# EAGLE schematic 1700-0002_InterfaceBoard_RevA (EAGLE 7.7.0)
DRAWING_DATE: 4/15/2022; DRAWING_TITLE: PQI380 UNIV. INTERFACE BRD; PART_NUMBER: 7000-0303; REV: R12

## Sheet 1 of 2
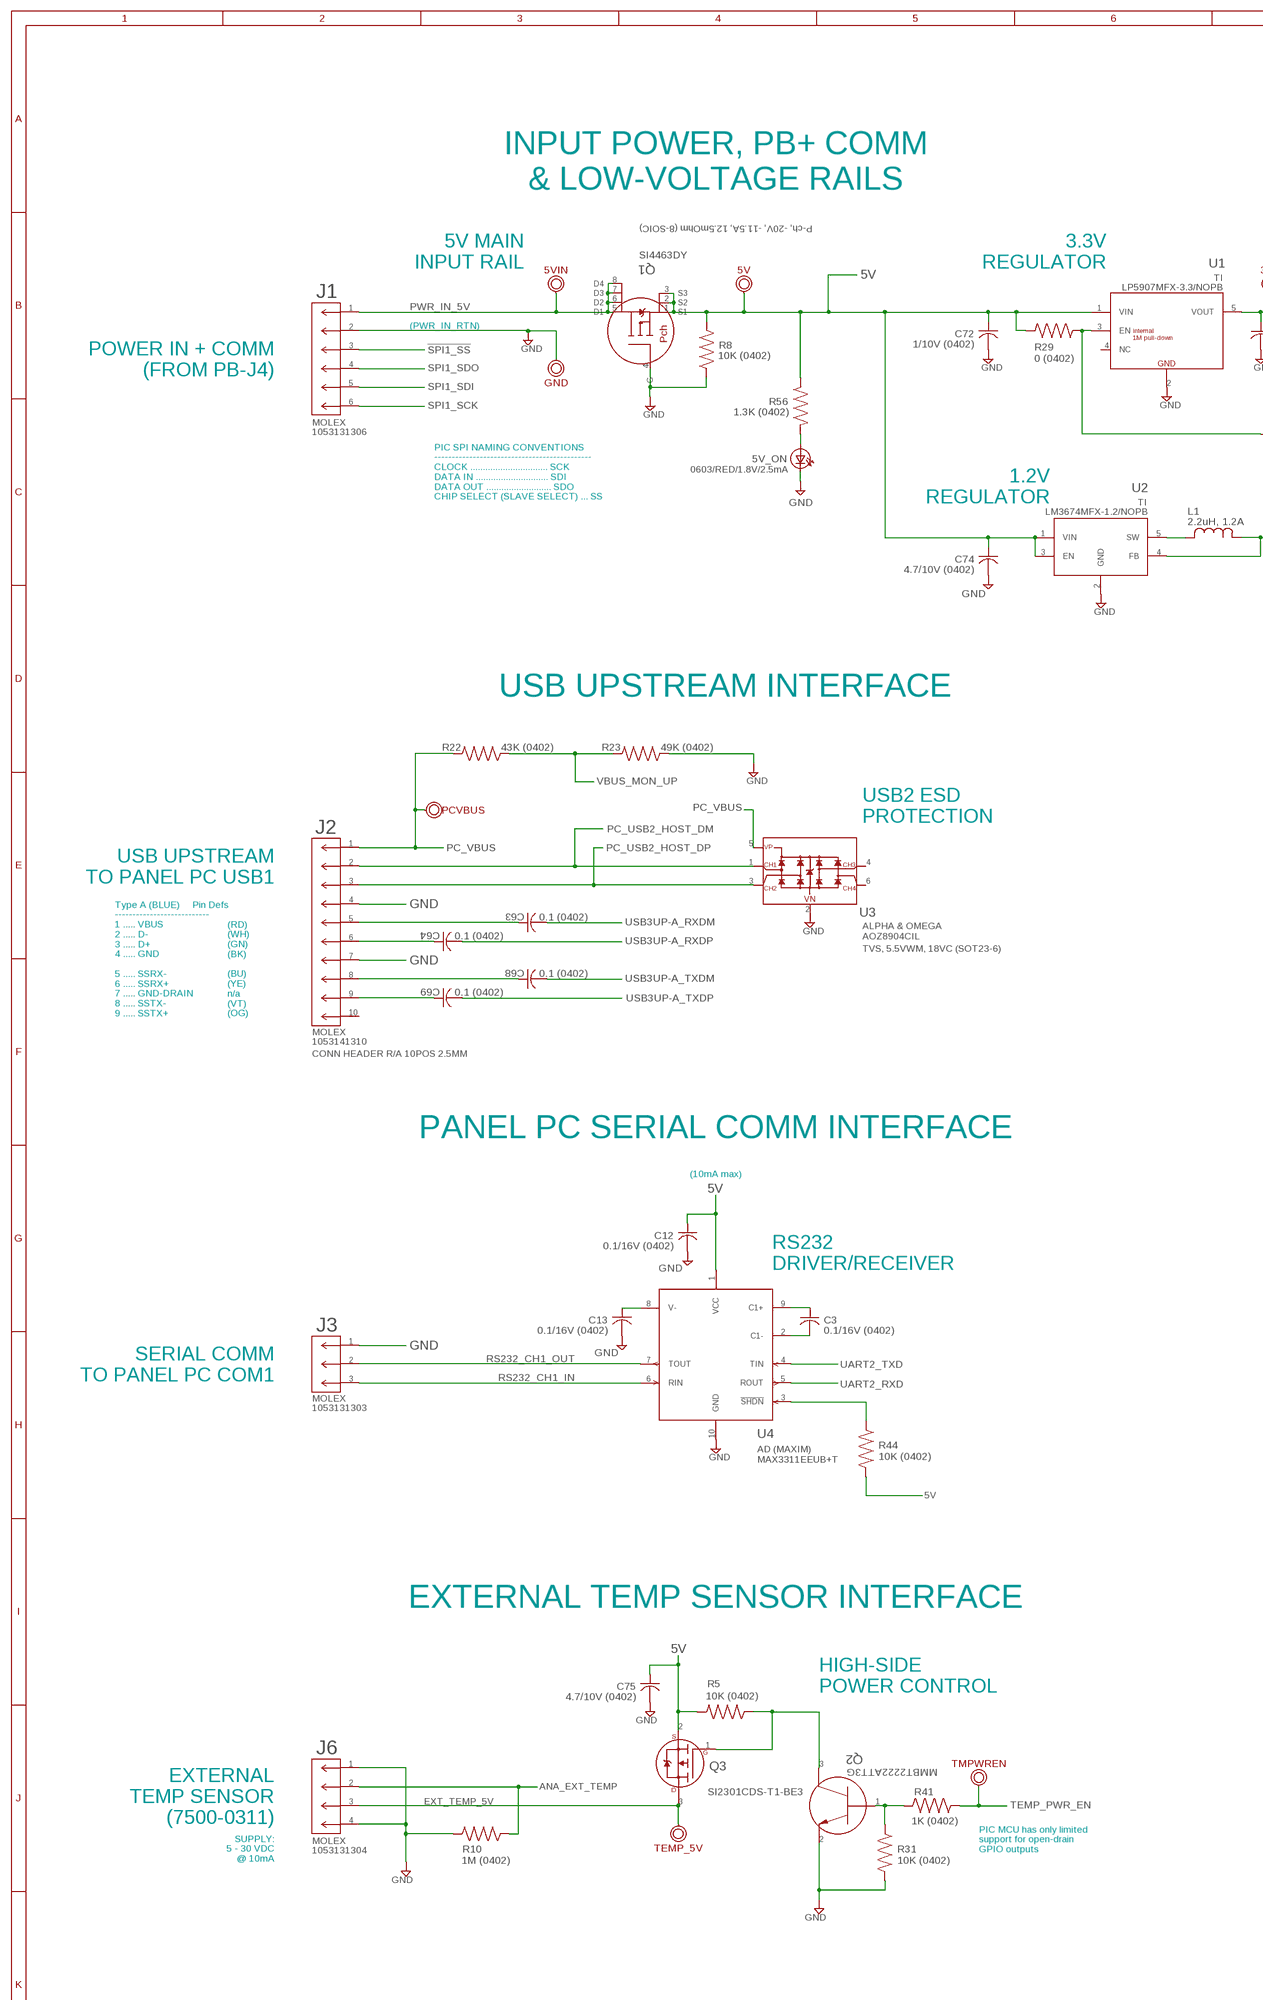
[diagram p0: schematic, sheet 1, part 1 of 3]
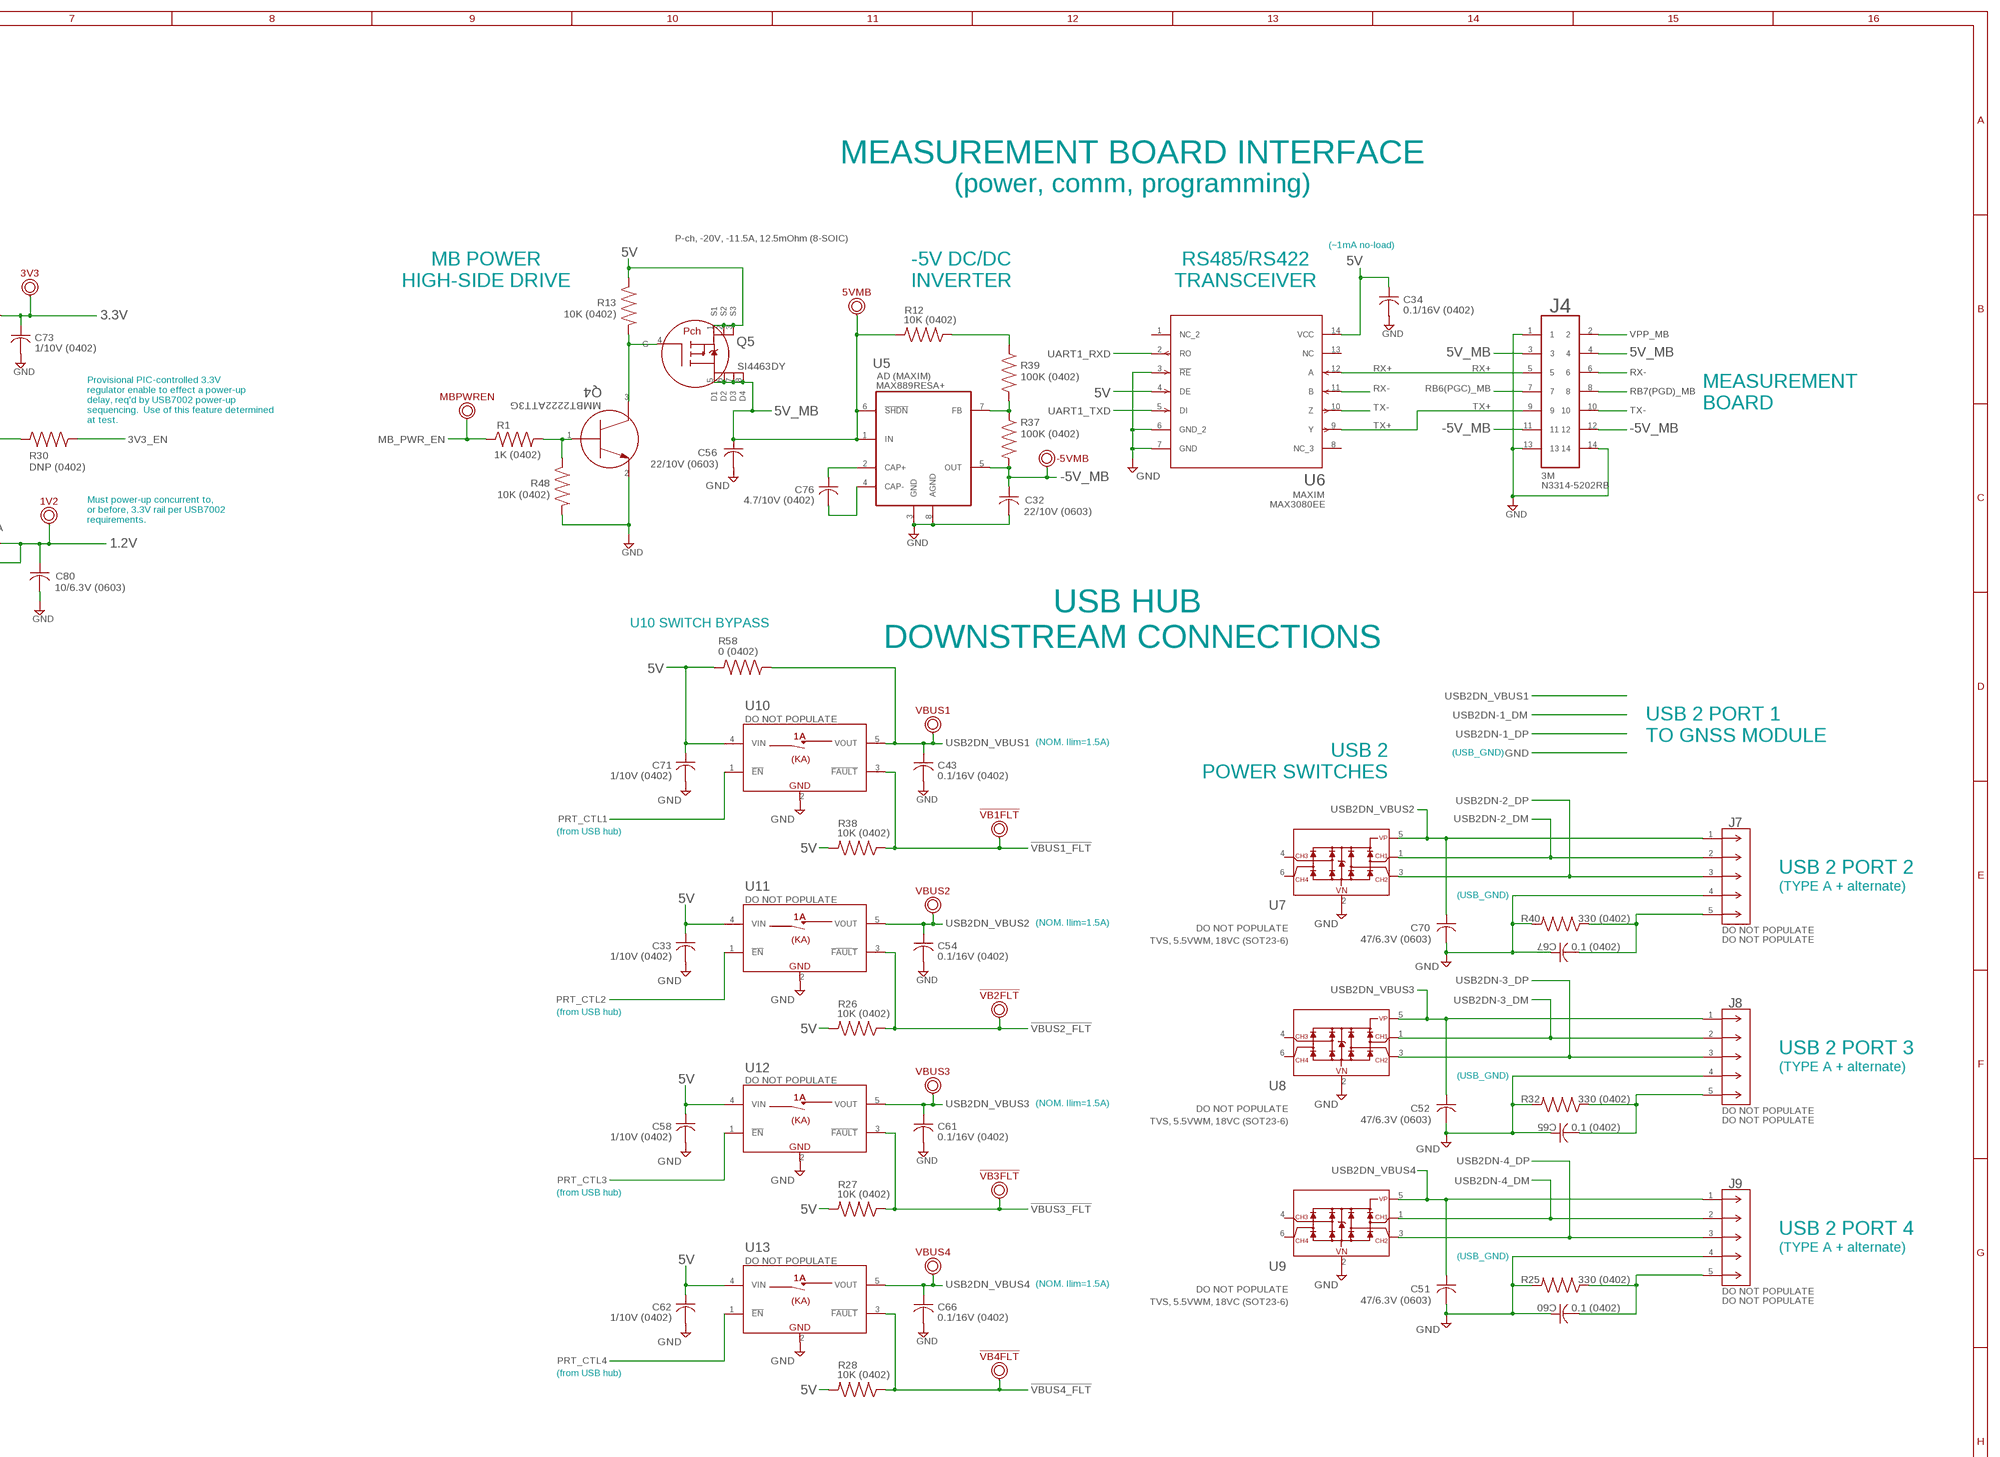
[diagram p1: schematic, sheet 1, part 2 of 3]
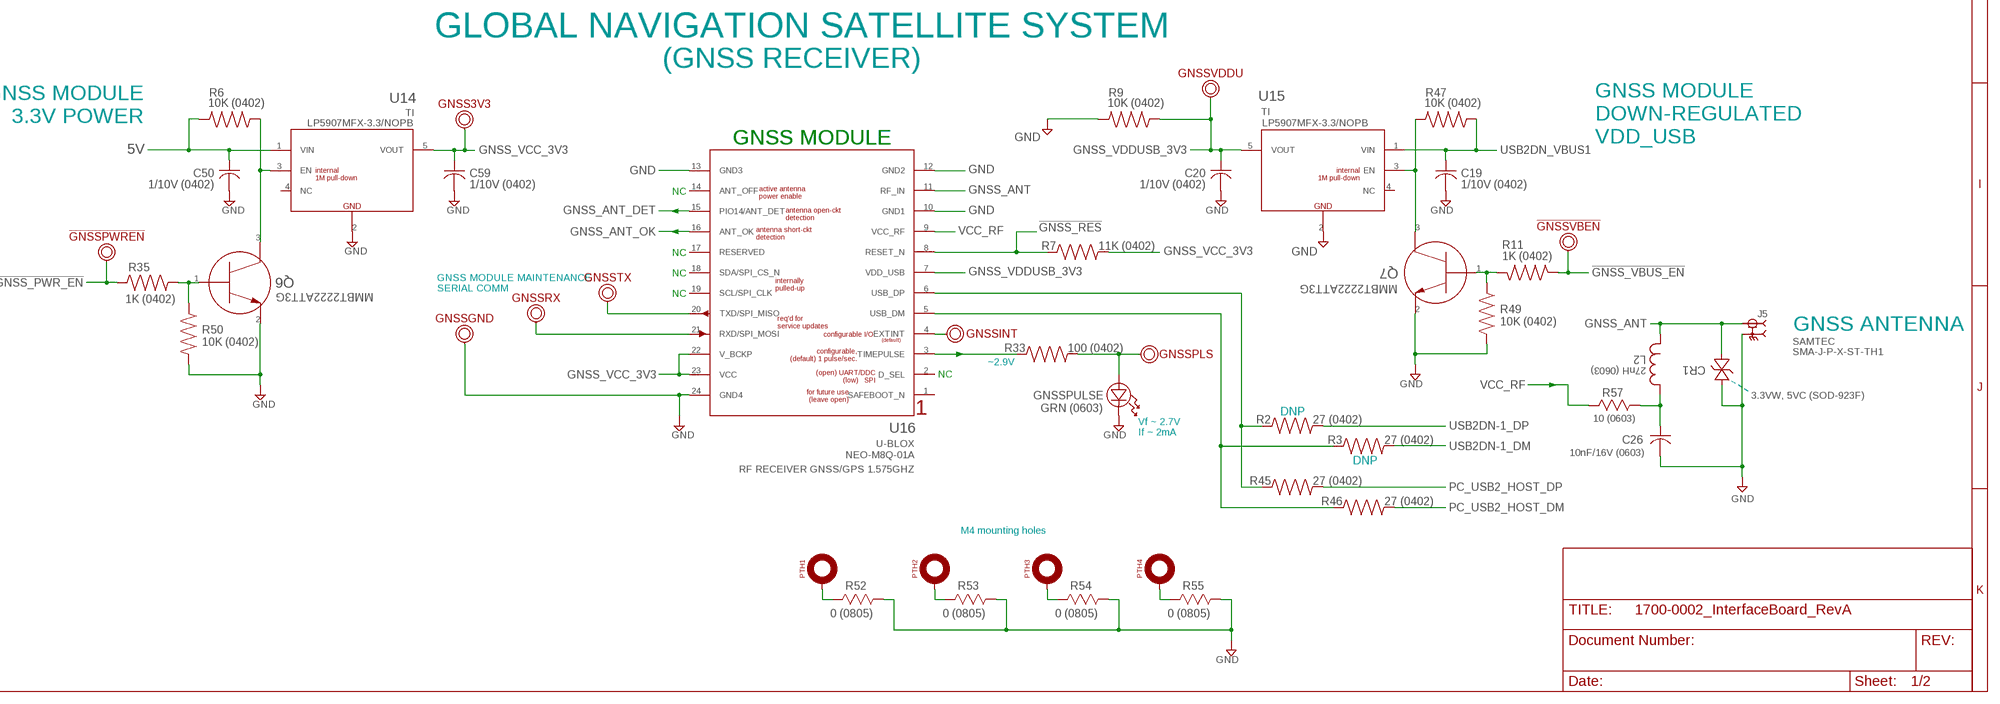
[diagram p2: schematic, sheet 1, part 3 of 3]
FRAME3 (FRAME_D_L): DWG-CO-NAME: TransTech Systems, Inc.; DWG-DATE: 4/22/2022; DWG-NUMBER: ____-____; DWG-REV: R0; DWG-TITLE: PQI380+ INTERFACE BOARD; SIZE: D

### Parts
1V2  TST_POINT_PTH_042-OCT  [TST_POINT_PTH_042-OCT]
3V3  TST_POINT_PTH_042-OCT  [TST_POINT_PTH_042-OCT]
5V  TST_POINT_PTH_042-OCT  [TST_POINT_PTH_042-OCT]
5V_ON  0603/RED/1.8V/2.5mA  LED_0603_LITE-ON_LTST-C193KRKT-2A  [LED_0603_LITE-ON]
5VIN  TST_POINT_PTH_042-OCT  [TST_POINT_PTH_042-OCT]
5VMB  TST_POINT_PTH_042-OCT  [TST_POINT_PTH_042-OCT]
!GNSSPWREN  TST_POINT_PTH_042-OCT  [TST_POINT_PTH_042-OCT]
!GNSSVBEN  TST_POINT_PTH_042-OCT  [TST_POINT_PTH_042-OCT]
!VB1FLT  TST_POINT_PTH_042-OCT  [TST_POINT_PTH_042-OCT]
!VB2FLT  TST_POINT_PTH_042-OCT  [TST_POINT_PTH_042-OCT]
!VB3FLT  TST_POINT_PTH_042-OCT  [TST_POINT_PTH_042-OCT]
!VB4FLT  TST_POINT_PTH_042-OCT  [TST_POINT_PTH_042-OCT]
-5VMB  TST_POINT_PTH_042-OCT  [TST_POINT_PTH_042-OCT]
C3  0.1/16V (0402)  CAP_CER_0402_MURATA  [G-155_MUR]
C12  0.1/16V (0402)  CAP_CER_0402_MURATA  [G-155_MUR]
C13  0.1/16V (0402)  CAP_CER_0402_MURATA  [G-155_MUR]
C19  1/10V (0402)  CAP_CER_0402_MURATA  [G-155_MUR]
C20  1/10V (0402)  CAP_CER_0402_MURATA  [G-155_MUR]
C26  10nF/16V (0603)  CAP_CER_0603_TDK  [CAP_C1608_TDK]
C32  22/10V (0603)  CAP_CER_0603_TDK  [CAP_C1608_TDK]
C33  1/10V (0402)  CAP_CER_0402_MURATA  [G-155_MUR]
C34  0.1/16V (0402)  CAP_CER_0402_MURATA  [G-155_MUR]
C43  0.1/16V (0402)  CAP_CER_0402_MURATA  [G-155_MUR]
C50  1/10V (0402)  CAP_CER_0402_MURATA  [G-155_MUR]
C51  47/6.3V (0603)  CAP_CER_0603_TDK  [CAP_C1608_TDK]
C52  47/6.3V (0603)  CAP_CER_0603_TDK  [CAP_C1608_TDK]
C54  0.1/16V (0402)  CAP_CER_0402_MURATA  [G-155_MUR]
C56  22/10V (0603)  CAP_CER_0603_TDK  [CAP_C1608_TDK]
C58  1/10V (0402)  CAP_CER_0402_MURATA  [G-155_MUR]
C59  1/10V (0402)  CAP_CER_0402_MURATA  [G-155_MUR]
C60  0.1 (0402)  CAP_CER_0402_MURATA  [G-155_MUR]
C61  0.1/16V (0402)  CAP_CER_0402_MURATA  [G-155_MUR]
C62  1/10V (0402)  CAP_CER_0402_MURATA  [G-155_MUR]
C63  0.1 (0402)  CAP_CER_0402_MURATA  [G-155_MUR]
C64  0.1 (0402)  CAP_CER_0402_MURATA  [G-155_MUR]
C65  0.1 (0402)  CAP_CER_0402_MURATA  [G-155_MUR]
C66  0.1/16V (0402)  CAP_CER_0402_MURATA  [G-155_MUR]
C67  0.1 (0402)  CAP_CER_0402_MURATA  [G-155_MUR]
C68  0.1 (0402)  CAP_CER_0402_MURATA  [G-155_MUR]
C69  0.1 (0402)  CAP_CER_0402_MURATA  [G-155_MUR]
C70  47/6.3V (0603)  CAP_CER_0603_TDK  [CAP_C1608_TDK]
C71  1/10V (0402)  CAP_CER_0402_MURATA  [G-155_MUR]
C72  1/10V (0402)  CAP_CER_0402_MURATA  [G-155_MUR]
C73  1/10V (0402)  CAP_CER_0402_MURATA  [G-155_MUR]
C74  4.7/10V (0402)  CAP_CER_0402_MURATA  [G-155_MUR]
C75  4.7/10V (0402)  CAP_CER_0402_MURATA  [G-155_MUR]
C76  4.7/10V (0402)  CAP_CER_0402_MURATA  [G-155_MUR]
C80  10/6.3V (0603)  CAP_CER_0603_TDK  [CAP_C1608_TDK]
CR1  3.3VW, 5VC (SOD-923F)  DIODE_TVS_BIDIRECT_COMCHIP  [SOD-923F_COMCHIP]
GND  TST_POINT_PTH_042-OCT  [TST_POINT_PTH_042-OCT]
GNSS3V3  TST_POINT_PTH_042-OCT  [TST_POINT_PTH_042-OCT]
GNSSGND  TST_POINT_PTH_042-OCT  [TST_POINT_PTH_042-OCT]
GNSSINT  TST_POINT_PTH_042-OCT  [TST_POINT_PTH_042-OCT]
GNSSPLS  TST_POINT_PTH_042-OCT  [TST_POINT_PTH_042-OCT]
GNSSPULSE  GRN (0603)  LED_0603  [LED_DIALIGHT_598_DIA]
GNSSRX  TST_POINT_PTH_042-OCT  [TST_POINT_PTH_042-OCT]
GNSSTX  TST_POINT_PTH_042-OCT  [TST_POINT_PTH_042-OCT]
GNSSVDDU  TST_POINT_PTH_042-OCT  [TST_POINT_PTH_042-OCT]
J1  CON_MOLEX_1053131306  [CON_1053131306]
J2  CON_MOLEX_1053141310  [CON_1053141310]
J3  CON_MOLEX_1053131303  [CON_1053131303]
J4  CON_3M_RA_N3314-5302RB  [3M_N3314-5302RB_RA]
J5  SAMTEC_SMA-J-P-X-ST-TH1_V.2  [SAMTEC_SMA-J-P-X-ST-TH1]
J6  CON_MOLEX_1053131304  [CON_1053131304]
J7  CON_MOLEX_1054301305  [CON_1054301305_MOL]
J8  CON_MOLEX_1054301305  [CON_1054301305_MOL]
J9  CON_MOLEX_1054301305  [CON_1054301305_MOL]
L1  2.2uH, 1.2A  IND_TAIYO-YUDEN_NR3012T2R2M  [IND_TAIYO_NR3012_TAY]
L2  27nH (0603)  INDUCTOR_0603_TDK  [INDUCTOR_0603_TDK]
MBPWREN  TST_POINT_PTH_042-OCT  [TST_POINT_PTH_042-OCT]
PCVBUS  TST_POINT_PTH_042-OCT  [TST_POINT_PTH_042-OCT]
PTH1  PTH_M4_4.5MM-ID_MIDDLE-FIT  [PTH_M4_4.5MM-ID]
PTH2  PTH_M4_4.5MM-ID_MIDDLE-FIT  [PTH_M4_4.5MM-ID]
PTH3  PTH_M4_4.5MM-ID_MIDDLE-FIT  [PTH_M4_4.5MM-ID]
PTH4  PTH_M4_4.5MM-ID_MIDDLE-FIT  [PTH_M4_4.5MM-ID]
Q1  P-ch, -20V, -11.5A, 12.5mOhm (8-SOIC)  FDS4435BZ  [SO-8L-NB_FAS]
Q2  MMBT2222ATT3G  [SC-75(SOT-416)_ONSEMI]
Q3  P-CH/-20V/-3A/0.09OHM  MOSFET_P-CH_VISHAY_SI2301CDS-T1-BE3  [SOT_1CDS-T1-BE3_VIS]
Q4  MMBT2222ATT3G  [SC-75(SOT-416)_ONSEMI]
Q5  P-ch, -20V, -11.5A, 12.5mOhm (8-SOIC)  FDS4435BZ  [SO-8L-NB_FAS]
Q6  MMBT2222ATT3G  [SC-75(SOT-416)_ONSEMI]
Q7  MMBT2222ATT3G  [SC-75(SOT-416)_ONSEMI]
R1  1K (0402)  RES_0402_VISHAY  [RESC1005X35N]
R2  27 (0402)  RES_0402_VISHAY  [RESC1005X35N]
R3  27 (0402)  RES_0402_VISHAY  [RESC1005X35N]
R5  10K (0402)  RES_0402_VISHAY  [RESC1005X35N]
R6  10K (0402)  RES_0402_VISHAY  [RESC1005X35N]
R7  11K (0402)  RES_0402_VISHAY  [RESC1005X35N]
R8  10K (0402)  RES_0402_VISHAY  [RESC1005X35N]
R9  10K (0402)  RES_0402_VISHAY  [RESC1005X35N]
R10  1M (0402)  RES_0402_VISHAY  [RESC1005X35N]
R11  1K (0402)  RES_0402_VISHAY  [RESC1005X35N]
R12  10K (0402)  RES_0402_VISHAY  [RESC1005X35N]
R13  10K (0402)  RES_0402_VISHAY  [RESC1005X35N]
R22  43K (0402)  RES_0402_VISHAY  [RESC1005X35N]
R23  49K (0402)  RES_0402_VISHAY  [RESC1005X35N]
R25  330 (0402)  RES_0402_VISHAY  [RESC1005X35N]
R26  10K (0402)  RES_0402_VISHAY  [RESC1005X35N]
R27  10K (0402)  RES_0402_VISHAY  [RESC1005X35N]
R28  10K (0402)  RES_0402_VISHAY  [RESC1005X35N]
R29  0 (0402)  RES_0402_VISHAY  [RESC1005X35N]
R30  DNP (0402)  RES_0402_VISHAY  [RESC1005X35N]
R31  10K (0402)  RES_0402_VISHAY  [RESC1005X35N]
R32  330 (0402)  RES_0402_VISHAY  [RESC1005X35N]
R33  100 (0402)  RES_0402_VISHAY  [RESC1005X35N]
R35  1K (0402)  RES_0402_VISHAY  [RESC1005X35N]
R37  100K (0402)  RES_0402_VISHAY  [RESC1005X35N]
R38  10K (0402)  RES_0402_VISHAY  [RESC1005X35N]
R39  100K (0402)  RES_0402_VISHAY  [RESC1005X35N]
R40  330 (0402)  RES_0402_VISHAY  [RESC1005X35N]
R41  1K (0402)  RES_0402_VISHAY  [RESC1005X35N]
R44  10K (0402)  RES_0402_VISHAY  [RESC1005X35N]
R45  27 (0402)  RES_0402_VISHAY  [RESC1005X35N]
R46  27 (0402)  RES_0402_VISHAY  [RESC1005X35N]
R47  10K (0402)  RES_0402_VISHAY  [RESC1005X35N]
R48  10K (0402)  RES_0402_VISHAY  [RESC1005X35N]
R49  10K (0402)  RES_0402_VISHAY  [RESC1005X35N]
R50  10K (0402)  RES_0402_VISHAY  [RESC1005X35N]
R52  0 (0805)  RES_0805_STACKPOLE  [STA_HCJ0805_STP]
R53  0 (0805)  RES_0805_STACKPOLE  [STA_HCJ0805_STP]
R54  0 (0805)  RES_0805_STACKPOLE  [STA_HCJ0805_STP]
R55  0 (0805)  RES_0805_STACKPOLE  [STA_HCJ0805_STP]
R56  1.3K (0402)  RES_0402_VISHAY  [RESC1005X35N]
R57  10 (0603)  RES_0603_STACKPOLE  [STA_RMCF0603_STP]
R58  0 (0402)  RES_0402_VISHAY  [RESC1005X35N]
TEMP_5V  TST_POINT_PTH_042-OCT  [TST_POINT_PTH_042-OCT]
TMPWREN  TST_POINT_PTH_042-OCT  [TST_POINT_PTH_042-OCT]
U1  TI_LP5907MFX-3.3/NOPBDBV0005A_L  [DBV0005A_L]
U2  TI_SW-REG_LM3671  [DBV5_TEX]
U3  TVS, 5.5VWM, 18VC (SOT23-6)  TVS_ALPHA-OEGA_AOZ8904CIL  [SOT-23-6_AOS]
U4  MAXIM_MAX3311EEUB+T  [21-0061L_MXM]
U5  MAXIM_MAX889RESA  [SOIC127P600X175-8N]
U6  MAX3080EESD+  [21-0041B_14_MXM]
U7  TVS, 5.5VWM, 18VC (SOT23-6)  TVS_ALPHA-OEGA_AOZ8904CIL  [SOT-23-6_AOS]
U8  TVS, 5.5VWM, 18VC (SOT23-6)  TVS_ALPHA-OEGA_AOZ8904CIL  [SOT-23-6_AOS]
U9  TVS, 5.5VWM, 18VC (SOT23-6)  TVS_ALPHA-OEGA_AOZ8904CIL  [SOT-23-6_AOS]
U10  SW_PWR_1CH_DIODES-INC_AP22816BKAWT  [TSOT-25_DIODES-INC]
U11  SW_PWR_1CH_DIODES-INC_AP22816BKAWT  [TSOT-25_DIODES-INC]
U12  SW_PWR_1CH_DIODES-INC_AP22816BKAWT  [TSOT-25_DIODES-INC]
U13  SW_PWR_1CH_DIODES-INC_AP22816BKAWT  [TSOT-25_DIODES-INC]
U14  TI_LP5907MFX-3.3/NOPBDBV0005A_L  [DBV0005A_L]
U15  TI_LP5907MFX-3.3/NOPBDBV0005A_L  [DBV0005A_L]
U16  MODULE_UBLOX_NEO-M8Q-01A  [UBLOX_24LCC]
VBUS1  TST_POINT_PTH_042-OCT  [TST_POINT_PTH_042-OCT]
VBUS2  TST_POINT_PTH_042-OCT  [TST_POINT_PTH_042-OCT]
VBUS3  TST_POINT_PTH_042-OCT  [TST_POINT_PTH_042-OCT]
VBUS4  TST_POINT_PTH_042-OCT  [TST_POINT_PTH_042-OCT]

### Nets
1.2V: 1V2.P$1 C80.1 L1.1 U2.4(FB) ; also sheet 2
3.3V: 3V3.P$1 C73.1 U1.5(VOUT) ; also sheet 2
3V3_EN: R30.2 ; also sheet 2
5V: 5V.P$1 C12.1 C33.1 C34.1 C50.1 C58.1 C62.1 C71.1 C72.1 C74.1 C75.1 Q1.1(S1) Q1.2(S2) Q1.3(S3) Q3.2(S) Q5.1(S1) Q5.2(S2) Q5.3(S3) R5.2 R6.2 R8.2 R13.1 R26.2 R27.2 R28.2 R29.1 R38.2 R44.2 R56.2 R58.1 U1.1(VIN) U2.1(VIN) U2.3(EN) U4.1(VCC) U6.4(DE) U6.14(VCC) U10.4(VIN) U11.4(VIN) U12.4(VIN) U13.4(VIN) U14.1(VIN) ; also sheet 2
5V_MB: 5VMB.P$1 C56.1 J4.3 J4.4 Q5.5(D1) Q5.6(D2) Q5.7(D3) Q5.8(D4) R12.2 U5.1(IN) U5.6(!SHDN) ; also sheet 2
!GNSS_PWR_EN: !GNSSPWREN.P$1 R35.1 ; also sheet 2
!GNSS_RES: R7.1 U16.8(RESET_N) ; also sheet 2
!GNSS_VBUS_EN: !GNSSVBEN.P$1 R11.1 ; also sheet 2
!SPI1_SS: J1.3 ; also sheet 2
!VBUS1_FLT: !VB1FLT.P$1 R38.1 U10.3(!FAULT) ; also sheet 2
!VBUS2_FLT: !VB2FLT.P$1 R26.1 U11.3(!FAULT) ; also sheet 2
!VBUS3_FLT: !VB3FLT.P$1 R27.1 U12.3(!FAULT) ; also sheet 2
!VBUS4_FLT: !VB4FLT.P$1 R28.1 U13.3(!FAULT) ; also sheet 2
-5V_MB: -5VMB.P$1 C32.1 J4.11 J4.12 R37.2 U5.5(OUT)
ANA_EXT_TEMP: J6.2 R10.1 ; also sheet 2
EXT_TEMP_5V: J6.3 Q3.3(D) TEMP_5V.P$1
GND: 5V_ON.1(K2) C12.2 C13.2 C19.2 C20.2 C26.2 C32.2 C33.2 C34.2 C43.2 C50.2 C51.2 C52.2 C54.2 C56.2 C58.2 C59.2 C60.1 C61.2 C62.2 C65.1 C66.2 C67.1 C70.2 C71.2 C72.2 C73.2 C74.2 C75.2 C80.2 CR1.2(K) GND.P$1 GNSSGND.P$1 GNSSPULSE.1 J1.2 J2.4 J2.7 J3.1 J4.1 J4.13 J4.14 J5.2 J5.3 J5.4 J5.5 J6.1 J6.4 J7.4 J8.4 J9.4 Q1.4(G) Q2.2(E) Q4.2(E) Q6.2(E) Q7.2(E) R8.1 R9.2 R10.2 R23.1 R25.2 R31.2 R32.2 R40.2 R48.2 R49.2 R50.2 R52.1 R53.1 R54.1 R55.1 U1.2(GND) U2.2(GND) U3.2(VN) U4.10(GND) U5.3(GND) U5.8(AGND) U6.3(!RE) U6.6(GND_2) U6.7(GND) U7.2(VN) U8.2(VN) U9.2(VN) U10.2(GND) U11.2(GND) U12.2(GND) U13.2(GND) U14.2(GND) U15.2(GND) U16.10(GND1) U16.12(GND2) U16.13(GND3) U16.24(GND4) ; also sheet 2
GNSS_ANT: CR1.1(A) J5.1 L2.1 U16.11(RF_IN)
GNSS_ANT_DET: U16.15(PIO14/ANT_DET) ; also sheet 2
GNSS_ANT_OK: U16.16(ANT_OK) ; also sheet 2
GNSS_VCC_3V3: C59.1 GNSS3V3.P$1 R7.2 U14.5(VOUT) U16.22(V_BCKP) U16.23(VCC)
GNSS_VDDUSB_3V3: C20.1 GNSSVDDU.P$1 R9.1 U15.5(VOUT) U16.7(VDD_USB)
MB_PWR_EN: MBPWREN.P$1 R1.1 ; also sheet 2
N$1: L1.2 U2.5(SW)
N$2: C3.1 U4.9(C1+)
N$3: PTH1.P$1 R52.2
N$4: C3.2 U4.2(C1-)
N$5: C13.1 U4.8(V-)
N$6: R29.2 R30.1 U1.3(EN)
N$8: PTH2.P$1 R53.2
N$9: Q2.3(C) Q3.1(G) R5.1
N$10: Q2.1(B) R31.1 R41.1
N$11: R2.1 R45.1 U16.6(USB_DP)
N$12: R3.1 R46.1 U16.5(USB_DM)
N$13: Q6.3(C) R6.1 U14.3(EN)
N$14: GNSSTX.P$1 U16.20(TXD/SPI_MISO)
N$15: PTH3.P$1 R54.2
N$16: Q6.1(B) R35.2 R50.1
N$17: Q7.3(C) R47.2 U15.3(EN)
N$18: C60.2 J9.5 R25.1
N$19: PTH4.P$1 R55.2
N$21: Q4.3(C) Q5.4(G) R13.2
N$22: C65.2 J8.5 R32.1
N$23: R37.1 R39.2 U5.7(FB)
N$24: C69.1 J2.9
N$25: C68.1 J2.8
N$26: C64.1 J2.6
N$27: C63.1 J2.5
N$36: Q4.1(B) R1.2 R48.1
N$38: GNSSRX.P$1 U16.21(RXD/SPI_MOSI)
N$41: R33.1 U16.3(TIMEPULSE)
N$42: GNSSINT.P$1 U16.4(EXTINT)
N$44: R12.1 R39.1
N$45: C76.1 U5.2(CAP+)
N$46: C76.2 U5.4(CAP-)
N$50: 5V_ON.2(A2) R56.1
N$51: GNSSPLS.P$1 GNSSPULSE.2 R33.2
N$52: C67.2 J7.5 R40.1
N$57: R44.1 U4.3(!SHDN)
N$59: C26.1 L2.2 R57.1
PC_USB2_HOST_DM: J2.2 R46.2 U3.1(CH1) ; also sheet 2
PC_USB2_HOST_DP: J2.3 R45.2 U3.3(CH2) ; also sheet 2
PC_VBUS: J2.1 PCVBUS.P$1 R22.2 U3.5(VP)
PRT_CTL1: U10.1(!EN) ; also sheet 2
PRT_CTL2: U11.1(!EN) ; also sheet 2
PRT_CTL3: U12.1(!EN) ; also sheet 2
PRT_CTL4: U13.1(!EN) ; also sheet 2
PWR_BYP2: Q7.1(B) R11.2 R49.1
PWR_IN_5V: 5VIN.P$1 J1.1 Q1.5(D1) Q1.6(D2) Q1.7(D3) Q1.8(D4)
RB6(PGC)_MB: J4.7 ; also sheet 2
RB7(PGD)_MB: J4.8 ; also sheet 2
RS232_CH1_IN: J3.3 U4.6(RIN)
RS232_CH1_OUT: J3.2 U4.7(TOUT)
RX+: J4.5 U6.12(A)
RX-: J4.6 U6.11(B)
SPI1_SCK: J1.6 ; also sheet 2
SPI1_SDI: J1.5 ; also sheet 2
SPI1_SDO: J1.4 ; also sheet 2
TEMP_PWR_EN: R41.2 TMPWREN.P$1 ; also sheet 2
TX+: J4.9 U6.9(Y)
TX-: J4.10 U6.10(Z)
UART1_RXD: U6.2(RO) ; also sheet 2
UART1_TXD: U6.5(DI) ; also sheet 2
UART2_RXD: U4.5(ROUT) ; also sheet 2
UART2_TXD: U4.4(TIN) ; also sheet 2
USB2DN-1_DM: R3.2 ; also sheet 2
USB2DN-1_DP: R2.2 ; also sheet 2
USB2DN-2_DM: J7.2 U7.1(CH1) ; also sheet 2
USB2DN-2_DP: J7.3 U7.3(CH2) ; also sheet 2
USB2DN-3_DM: J8.2 U8.1(CH1) ; also sheet 2
USB2DN-3_DP: J8.3 U8.3(CH2) ; also sheet 2
USB2DN-4_DM: J9.2 U9.1(CH1) ; also sheet 2
USB2DN-4_DP: J9.3 U9.3(CH2) ; also sheet 2
USB2DN_VBUS1: C19.1 C43.1 R47.1 R58.2 U10.5(VOUT) U15.1(VIN) VBUS1.P$1
USB2DN_VBUS2: C54.1 C70.1 J7.1 U7.5(VP) U11.5(VOUT) VBUS2.P$1
USB2DN_VBUS3: C52.1 C61.1 J8.1 U8.5(VP) U12.5(VOUT) VBUS3.P$1
USB2DN_VBUS4: C51.1 C66.1 J9.1 U9.5(VP) U13.5(VOUT) VBUS4.P$1
USB3UP-A_RXDM: C63.2 ; also sheet 2
USB3UP-A_RXDP: C64.2 ; also sheet 2
USB3UP-A_TXDM: C68.2 ; also sheet 2
USB3UP-A_TXDP: C69.2 ; also sheet 2
VBUS_MON_UP: R22.1 R23.2 ; also sheet 2
VCC_RF: R57.2 U16.9(VCC_RF)
VPP_MB: J4.2 ; also sheet 2
Unconnected: J2.10 U1.4(NC) U3.4(CH3) U3.6(CH4) U6.1(NC_2) U6.8(NC_3) U6.13(NC) U7.4(CH3) U7.6(CH4) U8.4(CH3) U8.6(CH4) U9.4(CH3) U9.6(CH4) U14.4(NC) U15.4(NC) U16.1(SAFEBOOT_N) U16.2(D_SEL) U16.14(ANT_OFF) U16.17(RESERVED) U16.18(SDA/SPI_CS_N) U16.19(SCL/SPI_CLK)

### Notes on the sheet
- MEASUREMENT BOARD INTERFACE
- INPUT POWER, PB+ COMM
  & LOW-VOLTAGE RAILS
- (power, comm, programming)
- (~1mA no-load)
- 5V MAIN
  INPUT RAIL
- 3.3V
  REGULATOR
- MB POWER
  HIGH-SIDE DRIVE
- -5V DC/DC
  INVERTER
- RS485/RS422
  TRANSCEIVER
- (PWR_IN_RTN)
- POWER IN + COMM
  (FROM PB-J4)
- Provisional PIC-controlled 3.3V
  regulator enable to effect a power-up
  delay, req'd by USB7002 power-up
  sequencing.  Use of this feature determined
  at test.
- MEASUREMENT
  BOARD
- Must power-up concurrent to,
  or before, 3.3V rail per USB7002
  requirements.
- PIC SPI NAMING CONVENTIONS
  ---------------------------------------------
  CLOCK ............................... SCK
  DATA IN ............................. SDI
  DATA OUT .......................... SDO
  CHIP SELECT (SLAVE SELECT) ... SS
- 1.2V
  REGULATOR
- U10 SWITCH BYPASS
- USB HUB 
  DOWNSTREAM CONNECTIONS
- USB UPSTREAM INTERFACE
- USB 2 PORT 1
  TO GNSS MODULE
- (NOM. Ilim=1.5A)
- (USB_GND)
- USB 2
  POWER SWITCHES
- USB2 ESD
  PROTECTION
- (from USB hub)
- USB 2 PORT 2
- USB UPSTREAM
  TO PANEL PC USB1
- (TYPE A + alternate)
- (USB_GND)
- (NOM. Ilim=1.5A)
- (from USB hub)
- Type A (BLUE)     Pin Defs
  ---------------------------
  1 ..... VBUS
  2 ..... D-
  3 ..... D+
  4 ..... GND
  
  5 ..... SSRX-
  6 ..... SSRX+
  7 ..... GND-DRAIN
  8 ..... SSTX-
  9 ..... SSTX+
- (RD)
  (WH)
  (GN)
  (BK)
  
  (BU)
  (YE)
  n/a
  (VT)
  (OG)
- USB 2 PORT 3
- (TYPE A + alternate)
- (USB_GND)
- (NOM. Ilim=1.5A)
- PANEL PC SERIAL COMM INTERFACE
- (10mA max)
- (from USB hub)
- USB 2 PORT 4
- (TYPE A + alternate)
- (USB_GND)
- RS232
  DRIVER/RECEIVER
- (NOM. Ilim=1.5A)
- (from USB hub)
- SERIAL COMM
  TO PANEL PC COM1
- GLOBAL NAVIGATION SATELLITE SYSTEM
- (GNSS RECEIVER)
- GNSS MODULE
  3.3V POWER
- GNSS MODULE
  DOWN-REGULATED
  VDD_USB
- GNSS MODULE | GNSS MODULE
- EXTERNAL TEMP SENSOR INTERFACE
- NC
- NC
- HIGH-SIDE
  POWER CONTROL
- NC
- GNSS MODULE MAINTENANCE
  SERIAL COMM
- NC
- GNSS ANTENNA
- ~2.9V
- NC
- EXTERNAL
  TEMP SENSOR
  (7500-0311)
- DNP
- Vf ~ 2.7V
  If ~ 2mA
- PIC MCU has only limited
  support for open-drain
  GPIO outputs
- SUPPLY:
  5 - 30 VDC
  @ 10mA
- DNP
- M4 mounting holes

## Sheet 2 of 2
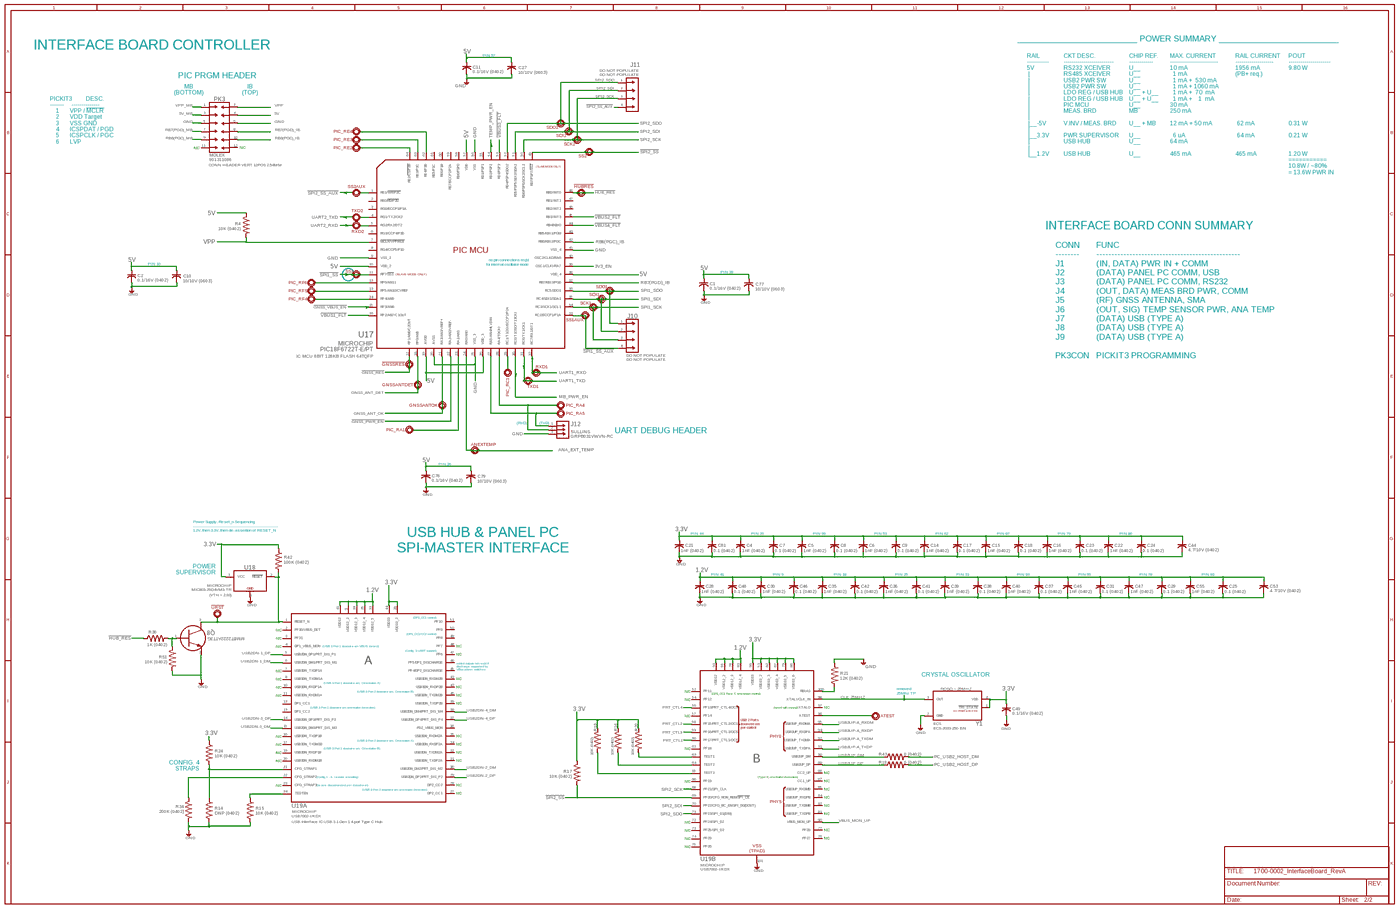
[diagram p3: schematic, sheet 2, overview]
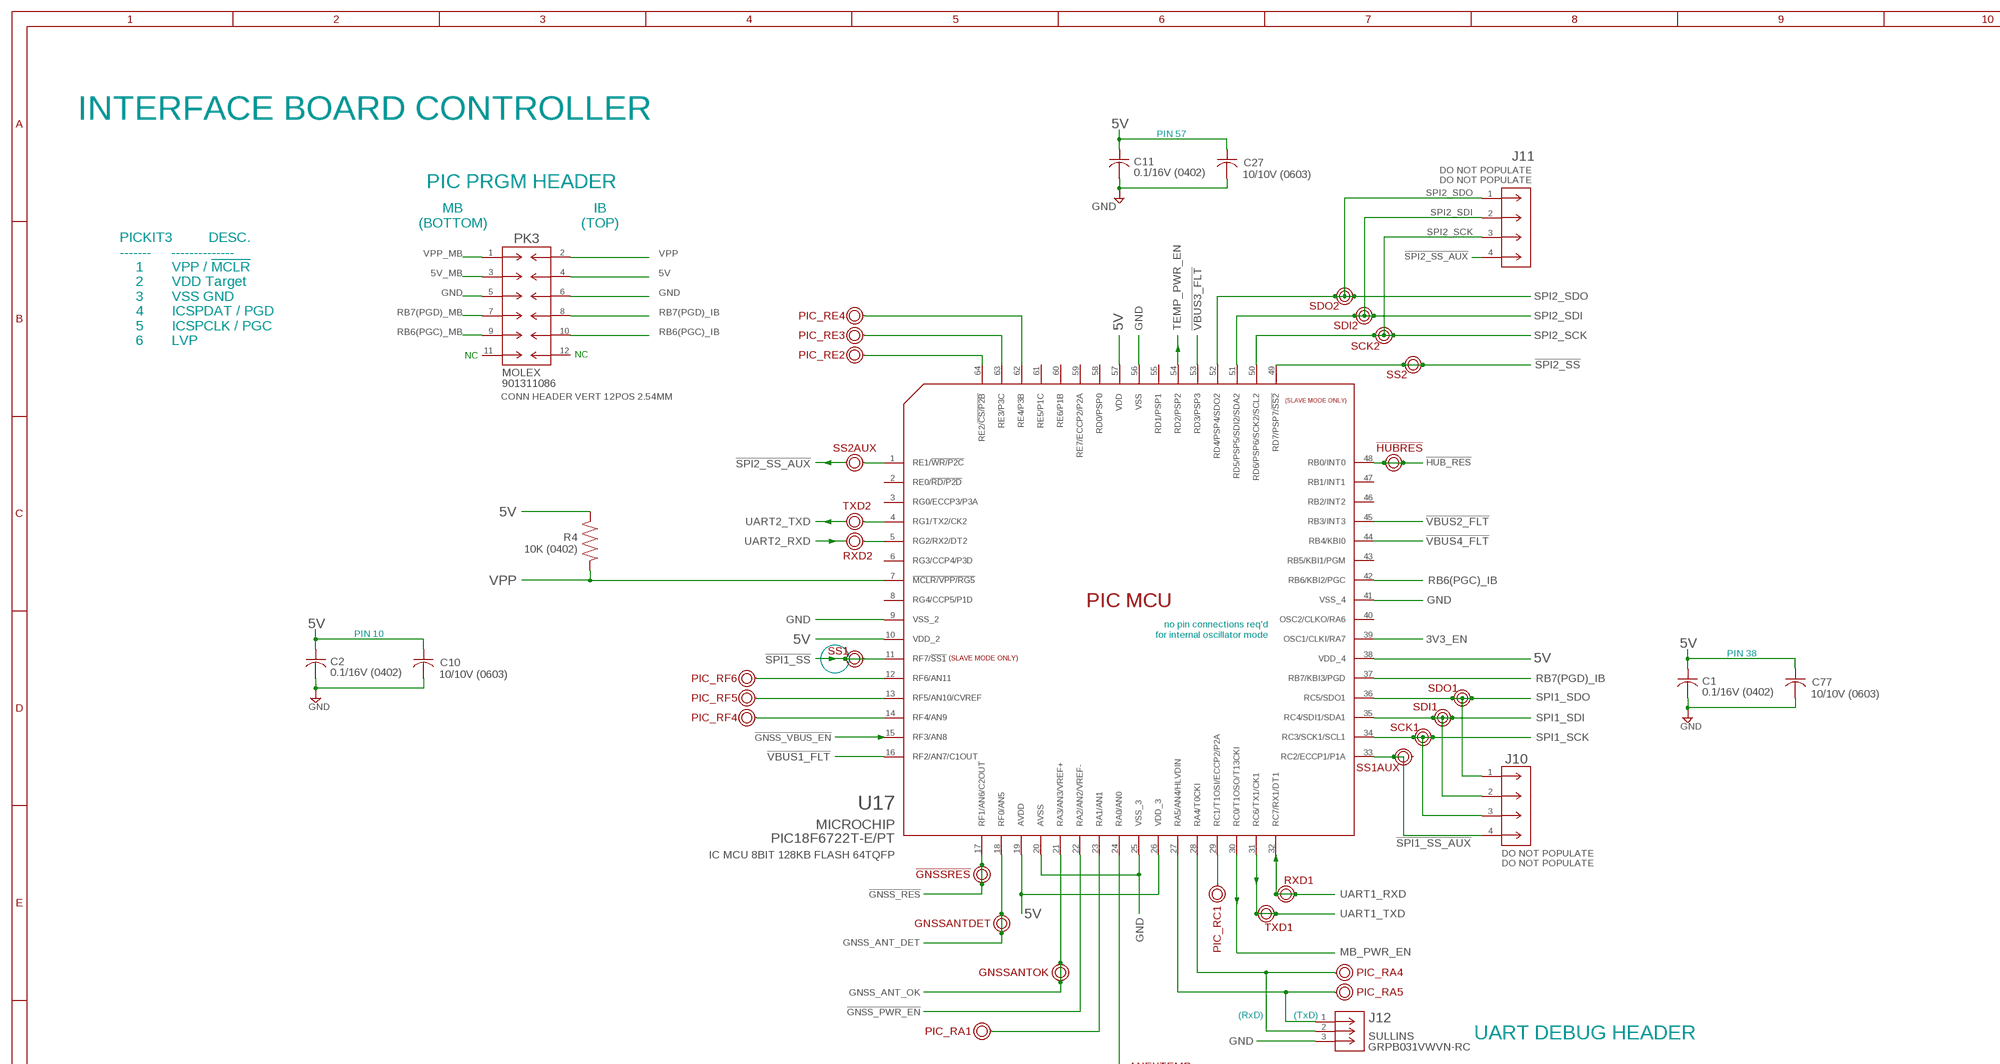
[diagram p4: schematic, sheet 2, part 1 of 4]
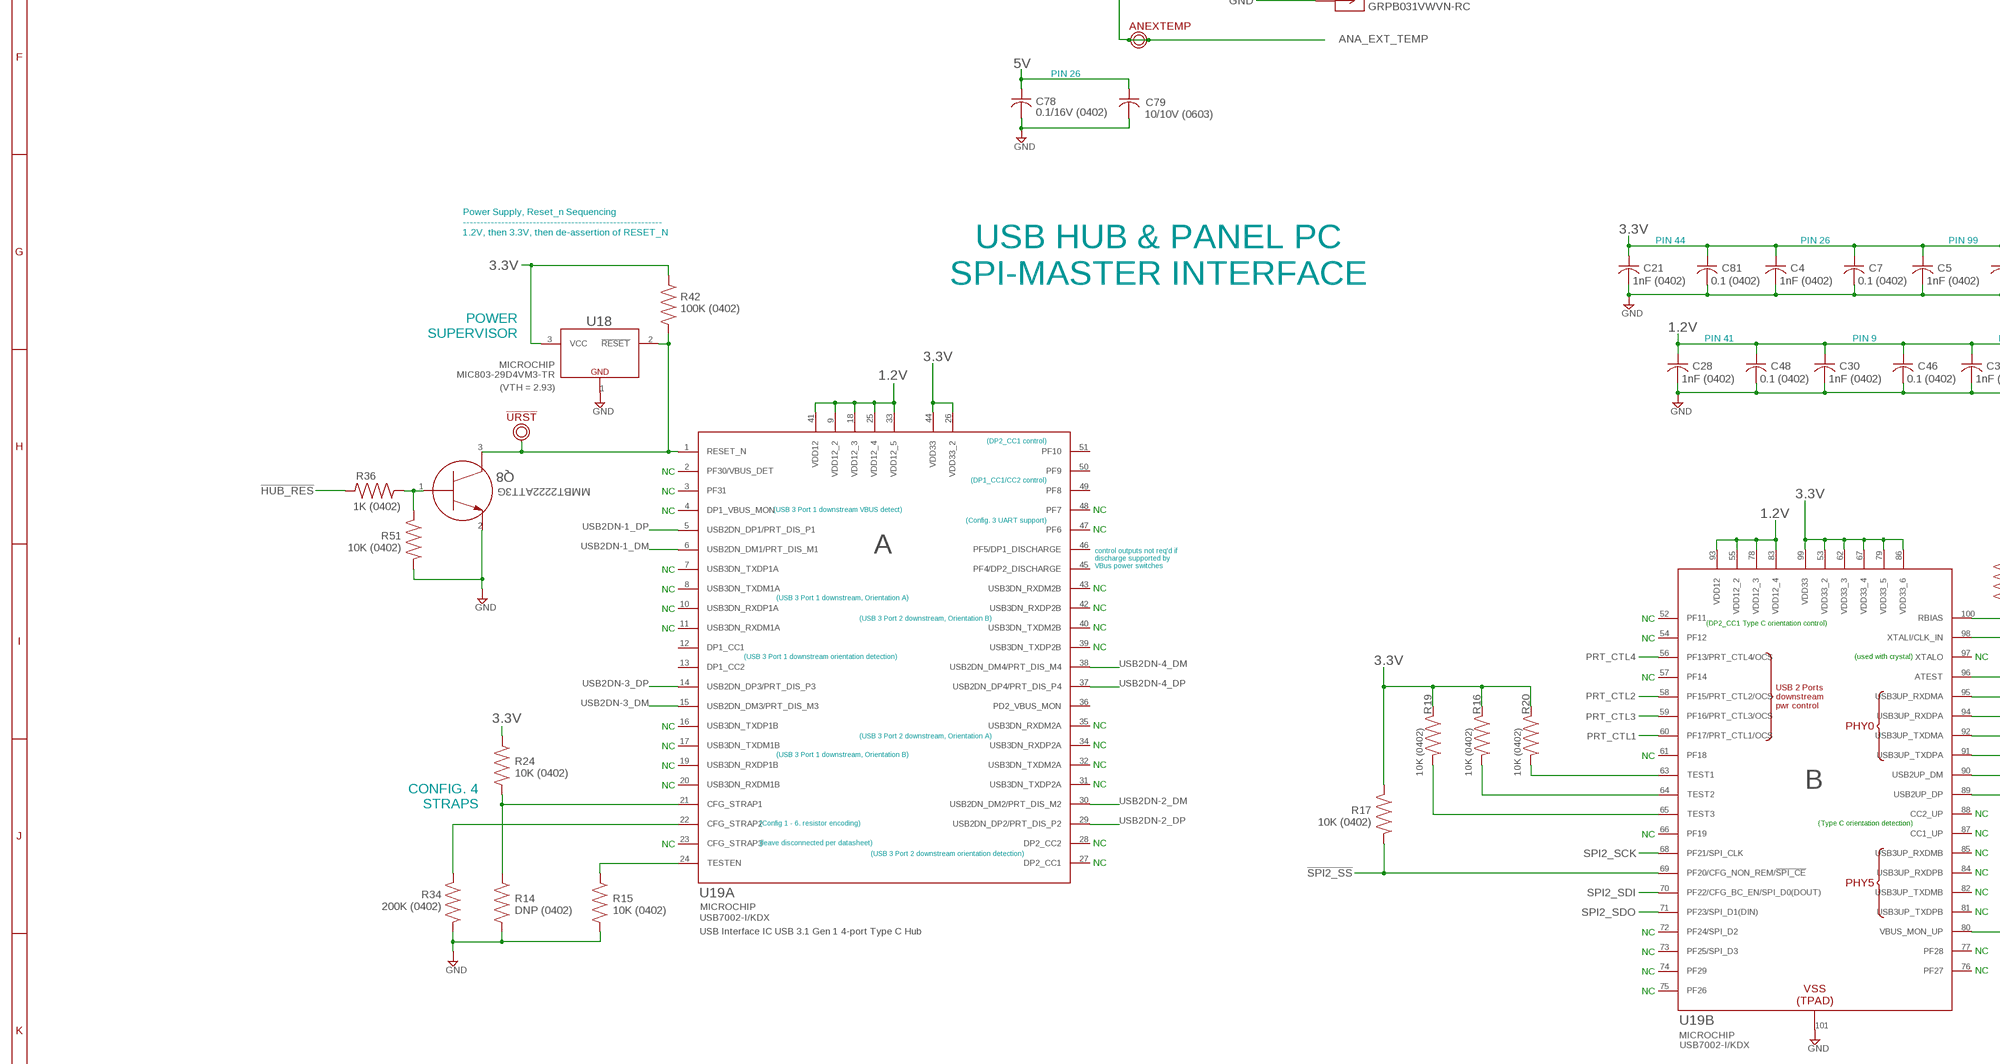
[diagram p5: schematic, sheet 2, part 2 of 4]
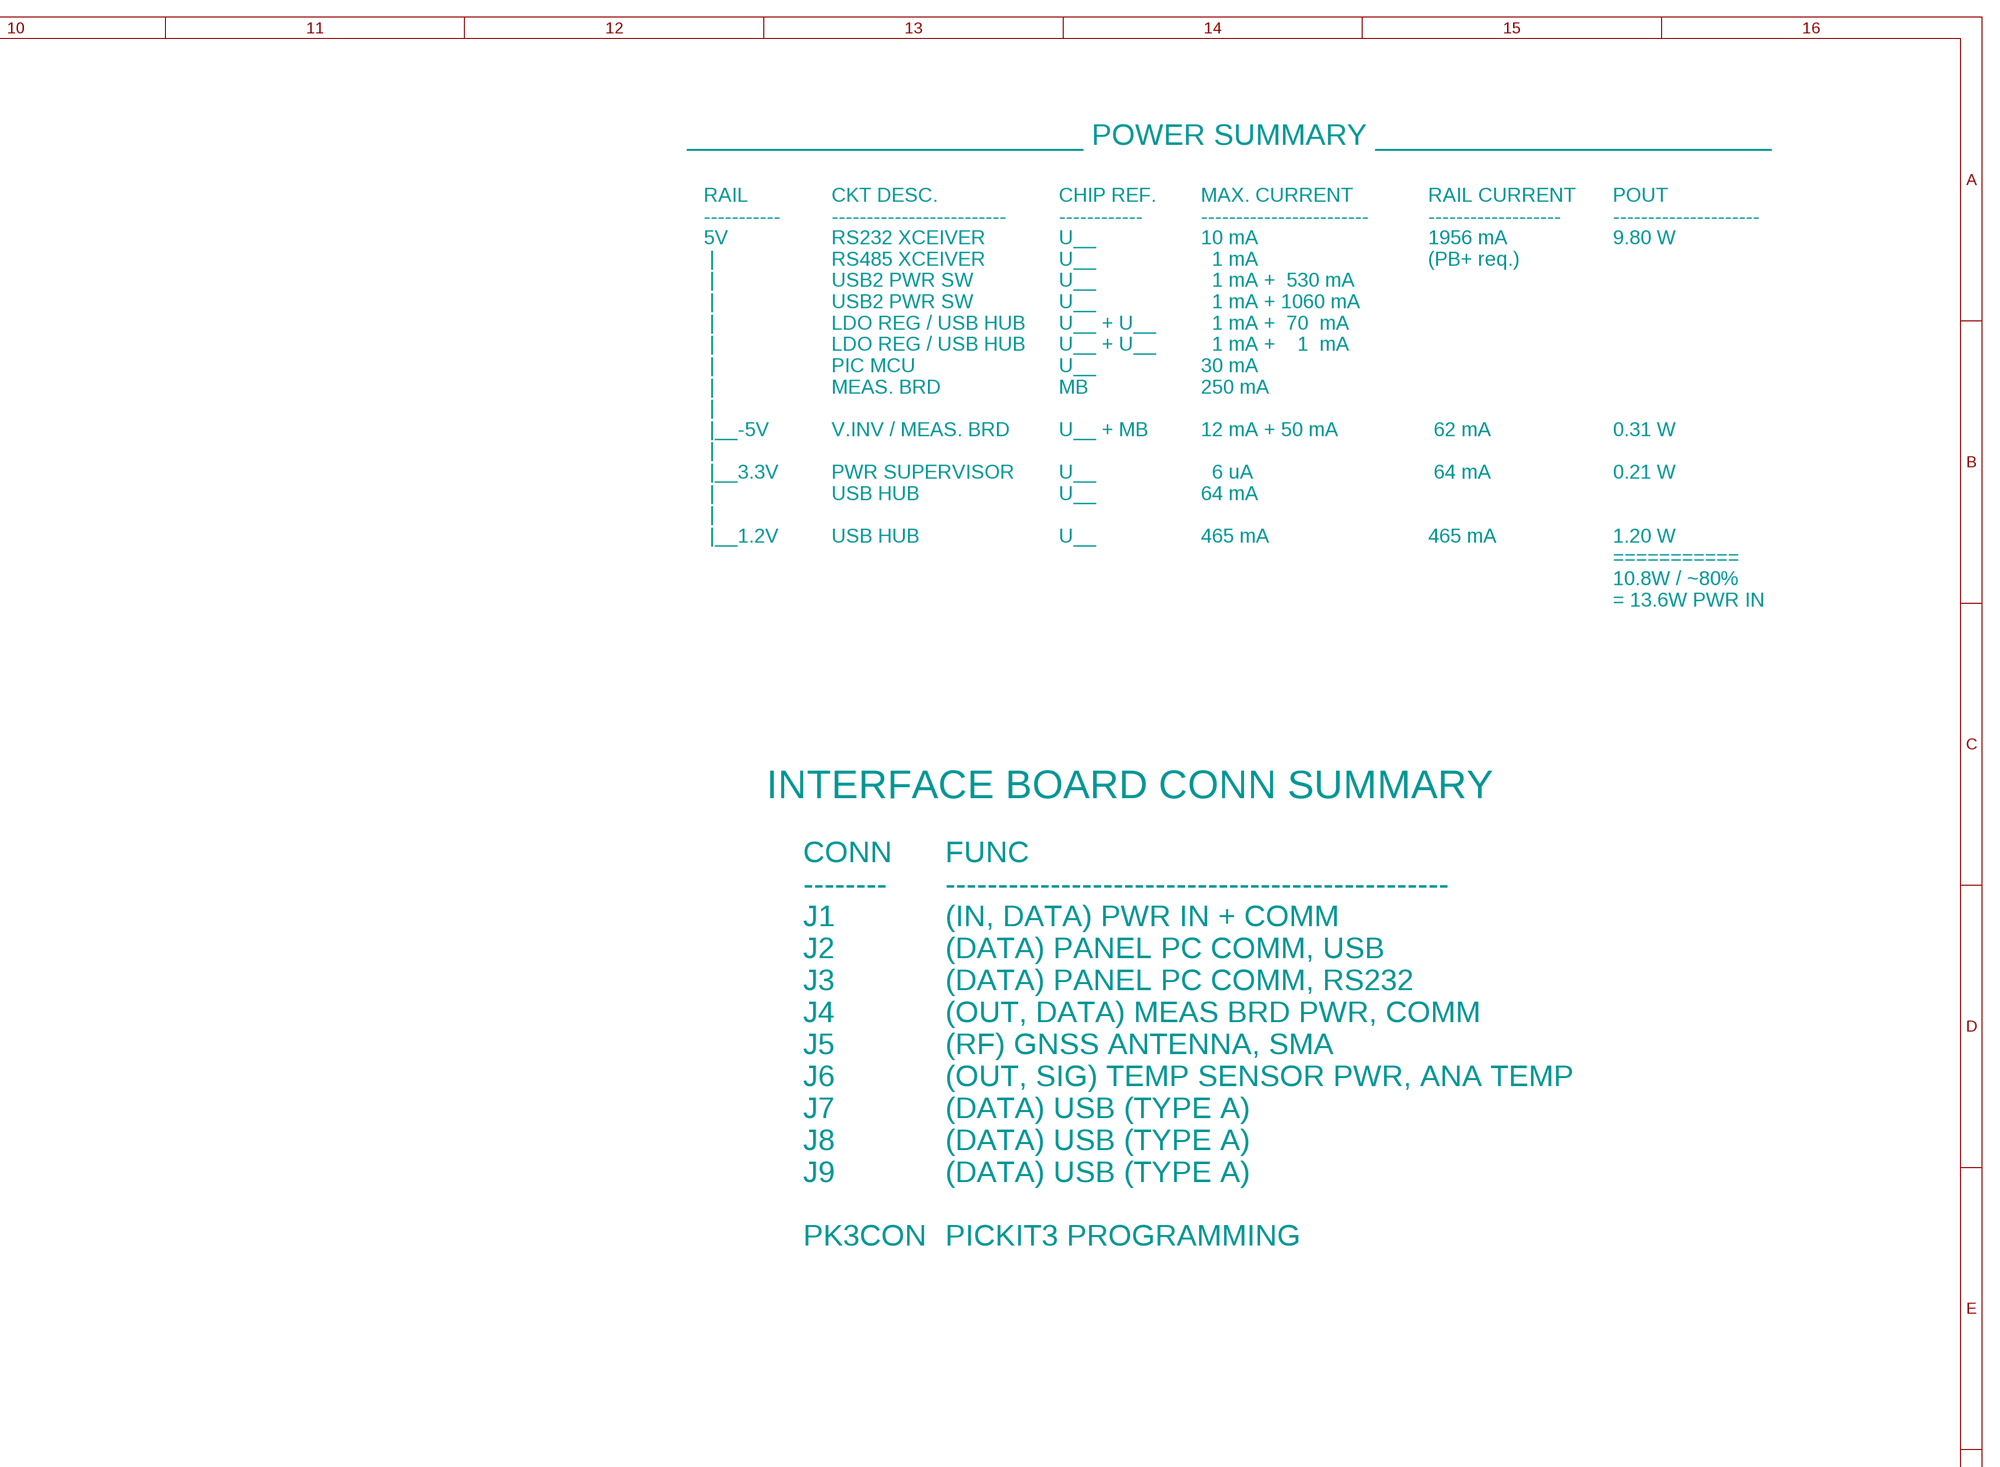
[diagram p6: schematic, sheet 2, part 3 of 4]
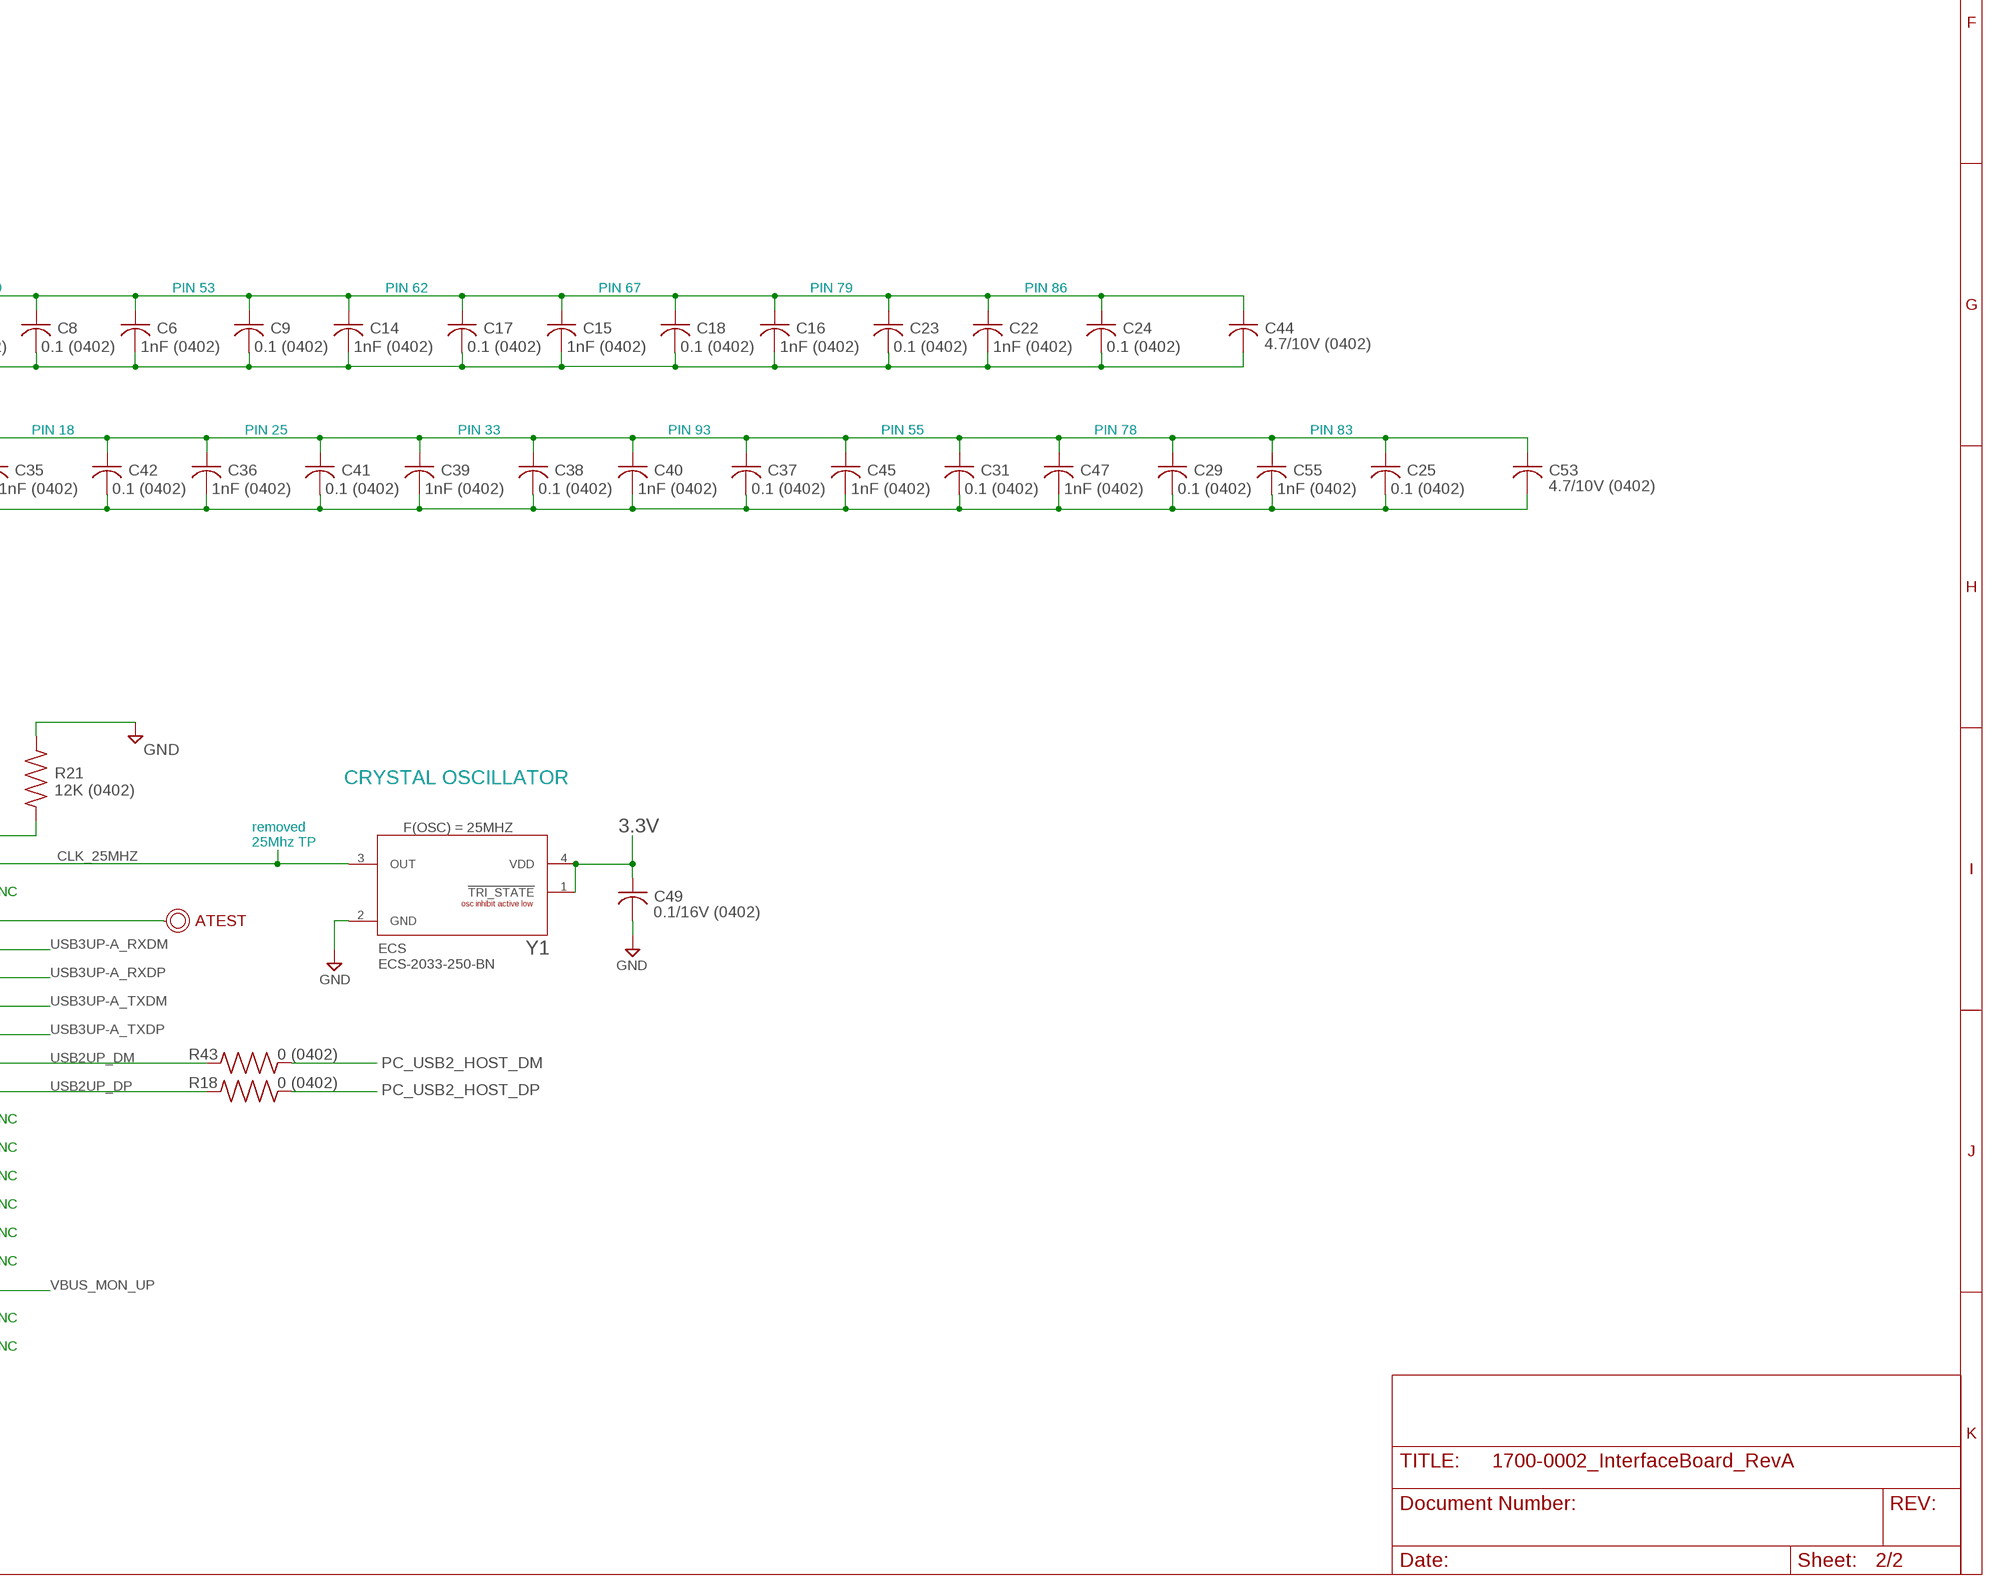
[diagram p7: schematic, sheet 2, part 4 of 4]
FRAME5 (FRAME_D_L): DWG-CO-NAME: TransTech Systems, Inc.; DWG-DATE: 4/22/2022; DWG-NUMBER: ____-____; DWG-REV: R0; DWG-TITLE: PQI380+ INTERFACE BOARD; SIZE: D

### Parts
!GNSSRES  TST_POINT_PTH_20X40MIL_2PIN  [TST_POINT_PTH_20X40MIL_2PIN]
!HUBRES  TST_POINT_PTH_20X40MIL_2PIN  [TST_POINT_PTH_20X40MIL_2PIN]
!URST  TST_POINT_PTH_042-OCT  [TST_POINT_PTH_042-OCT]
ANEXTEMP  TST_POINT_PTH_20X40MIL_2PIN  [TST_POINT_PTH_20X40MIL_2PIN]
ATEST  TST_POINT_PTH_042-OCT  [TST_POINT_PTH_042-OCT]
C1  0.1/16V (0402)  CAP_CER_0402_MURATA  [G-155_MUR]
C2  0.1/16V (0402)  CAP_CER_0402_MURATA  [G-155_MUR]
C4  1nF (0402)  CAP_CER_0402_MURATA  [G-155_MUR]
C5  1nF (0402)  CAP_CER_0402_MURATA  [G-155_MUR]
C6  1nF (0402)  CAP_CER_0402_MURATA  [G-155_MUR]
C7  0.1 (0402)  CAP_CER_0402_MURATA  [G-155_MUR]
C8  0.1 (0402)  CAP_CER_0402_MURATA  [G-155_MUR]
C9  0.1 (0402)  CAP_CER_0402_MURATA  [G-155_MUR]
C10  10/10V (0603)  CAP_CER_0603_TDK  [CAP_C1608_TDK]
C11  0.1/16V (0402)  CAP_CER_0402_MURATA  [G-155_MUR]
C14  1nF (0402)  CAP_CER_0402_MURATA  [G-155_MUR]
C15  1nF (0402)  CAP_CER_0402_MURATA  [G-155_MUR]
C16  1nF (0402)  CAP_CER_0402_MURATA  [G-155_MUR]
C17  0.1 (0402)  CAP_CER_0402_MURATA  [G-155_MUR]
C18  0.1 (0402)  CAP_CER_0402_MURATA  [G-155_MUR]
C21  1nF (0402)  CAP_CER_0402_MURATA  [G-155_MUR]
C22  1nF (0402)  CAP_CER_0402_MURATA  [G-155_MUR]
C23  0.1 (0402)  CAP_CER_0402_MURATA  [G-155_MUR]
C24  0.1 (0402)  CAP_CER_0402_MURATA  [G-155_MUR]
C25  0.1 (0402)  CAP_CER_0402_MURATA  [G-155_MUR]
C27  10/10V (0603)  CAP_CER_0603_TDK  [CAP_C1608_TDK]
C28  1nF (0402)  CAP_CER_0402_MURATA  [G-155_MUR]
C29  0.1 (0402)  CAP_CER_0402_MURATA  [G-155_MUR]
C30  1nF (0402)  CAP_CER_0402_MURATA  [G-155_MUR]
C31  0.1 (0402)  CAP_CER_0402_MURATA  [G-155_MUR]
C35  1nF (0402)  CAP_CER_0402_MURATA  [G-155_MUR]
C36  1nF (0402)  CAP_CER_0402_MURATA  [G-155_MUR]
C37  0.1 (0402)  CAP_CER_0402_MURATA  [G-155_MUR]
C38  0.1 (0402)  CAP_CER_0402_MURATA  [G-155_MUR]
C39  1nF (0402)  CAP_CER_0402_MURATA  [G-155_MUR]
C40  1nF (0402)  CAP_CER_0402_MURATA  [G-155_MUR]
C41  0.1 (0402)  CAP_CER_0402_MURATA  [G-155_MUR]
C42  0.1 (0402)  CAP_CER_0402_MURATA  [G-155_MUR]
C44  4.7/10V (0402)  CAP_CER_0402_MURATA  [G-155_MUR]
C45  1nF (0402)  CAP_CER_0402_MURATA  [G-155_MUR]
C46  0.1 (0402)  CAP_CER_0402_MURATA  [G-155_MUR]
C47  1nF (0402)  CAP_CER_0402_MURATA  [G-155_MUR]
C48  0.1 (0402)  CAP_CER_0402_MURATA  [G-155_MUR]
C49  0.1/16V (0402)  CAP_CER_0402_MURATA  [G-155_MUR]
C53  4.7/10V (0402)  CAP_CER_0402_MURATA  [G-155_MUR]
C55  1nF (0402)  CAP_CER_0402_MURATA  [G-155_MUR]
C77  10/10V (0603)  CAP_CER_0603_TDK  [CAP_C1608_TDK]
C78  0.1/16V (0402)  CAP_CER_0402_MURATA  [G-155_MUR]
C79  10/10V (0603)  CAP_CER_0603_TDK  [CAP_C1608_TDK]
C81  0.1 (0402)  CAP_CER_0402_MURATA  [G-155_MUR]
GNSSANTDET  TST_POINT_PTH_20X40MIL_2PIN  [TST_POINT_PTH_20X40MIL_2PIN]
GNSSANTOK  TST_POINT_PTH_20X40MIL_2PIN  [TST_POINT_PTH_20X40MIL_2PIN]
J10  MOLEX_VERT-HDR_1718561004  [MOLEX_VERT-HDR_171861004]
J11  MOLEX_VERT-HDR_1718561004  [MOLEX_VERT-HDR_171861004]
J12  SULLINS_MALE-HDR_050_GRPB031VWVN-RC  [CONN_GRPB031VWVN-RC_SUL]
PIC_RA1  TST_POINT_PTH_042-OCT  [TST_POINT_PTH_042-OCT]
PIC_RA4  TST_POINT_PTH_042-OCT  [TST_POINT_PTH_042-OCT]
PIC_RA5  TST_POINT_PTH_042-OCT  [TST_POINT_PTH_042-OCT]
PIC_RC1  TST_POINT_PTH_042-OCT  [TST_POINT_PTH_042-OCT]
PIC_RE2  TST_POINT_PTH_042-OCT  [TST_POINT_PTH_042-OCT]
PIC_RE3  TST_POINT_PTH_042-OCT  [TST_POINT_PTH_042-OCT]
PIC_RE4  TST_POINT_PTH_042-OCT  [TST_POINT_PTH_042-OCT]
PIC_RF4  TST_POINT_PTH_042-OCT  [TST_POINT_PTH_042-OCT]
PIC_RF5  TST_POINT_PTH_042-OCT  [TST_POINT_PTH_042-OCT]
PIC_RF6  TST_POINT_PTH_042-OCT  [TST_POINT_PTH_042-OCT]
PK3  CON_MOLEX_901311086  [CON_901311086_MOL]
Q8  MMBT2222ATT3G  [SC-75(SOT-416)_ONSEMI]
R4  10K (0402)  RES_0402_VISHAY  [RESC1005X35N]
R14  DNP (0402)  RES_0402_VISHAY  [RESC1005X35N]
R15  10K (0402)  RES_0402_VISHAY  [RESC1005X35N]
R16  10K (0402)  RES_0402_VISHAY  [RESC1005X35N]
R17  10K (0402)  RES_0402_VISHAY  [RESC1005X35N]
R18  0 (0402)  RES_0402_VISHAY  [RESC1005X35N]
R19  10K (0402)  RES_0402_VISHAY  [RESC1005X35N]
R20  10K (0402)  RES_0402_VISHAY  [RESC1005X35N]
R21  12K (0402)  RES_0402_VISHAY  [RESC1005X35N]
R24  10K (0402)  RES_0402_VISHAY  [RESC1005X35N]
R34  200K (0402)  RES_0402_VISHAY  [RESC1005X35N]
R36  1K (0402)  RES_0402_VISHAY  [RESC1005X35N]
R42  100K (0402)  RES_0402_VISHAY  [RESC1005X35N]
R43  0 (0402)  RES_0402_VISHAY  [RESC1005X35N]
R51  10K (0402)  RES_0402_VISHAY  [RESC1005X35N]
RXD1  TST_POINT_PTH_20X40MIL_2PIN  [TST_POINT_PTH_20X40MIL_2PIN]
RXD2  TST_POINT_PTH_20X40MIL_2PIN  [TST_POINT_PTH_20X40MIL_2PIN]
SCK1  TST_POINT_PTH_20X40MIL_2PIN  [TST_POINT_PTH_20X40MIL_2PIN]
SCK2  TST_POINT_PTH_20X40MIL_2PIN  [TST_POINT_PTH_20X40MIL_2PIN]
SDI1  TST_POINT_PTH_20X40MIL_2PIN  [TST_POINT_PTH_20X40MIL_2PIN]
SDI2  TST_POINT_PTH_20X40MIL_2PIN  [TST_POINT_PTH_20X40MIL_2PIN]
SDO1  TST_POINT_PTH_20X40MIL_2PIN  [TST_POINT_PTH_20X40MIL_2PIN]
SDO2  TST_POINT_PTH_20X40MIL_2PIN  [TST_POINT_PTH_20X40MIL_2PIN]
SS1  TST_POINT_PTH_20X40MIL_2PIN  [TST_POINT_PTH_20X40MIL_2PIN]
SS1AUX  TST_POINT_PTH_20X40MIL_2PIN  [TST_POINT_PTH_20X40MIL_2PIN]
SS2  TST_POINT_PTH_20X40MIL_2PIN  [TST_POINT_PTH_20X40MIL_2PIN]
SS2AUX  TST_POINT_PTH_20X40MIL_2PIN  [TST_POINT_PTH_20X40MIL_2PIN]
TXD1  TST_POINT_PTH_20X40MIL_2PIN  [TST_POINT_PTH_20X40MIL_2PIN]
TXD2  TST_POINT_PTH_20X40MIL_2PIN  [TST_POINT_PTH_20X40MIL_2PIN]
U17  PIC18F6627T-E/PT  [TQFP64_10X10MC_MCH]
U18  (VTH = 2.93)  MICROCHIP_MIC803-29D4VM3  [SOT-23_M3_MCH]
U19  MICROCHIP_USB7002-I/KDX  [VQFN100_KDX_MCH]
Y1  F(OSC) = 25MHZ  CRYSTAL_OSC_ECS-2033-250-BN  [OSC_ECS-2033-250-BN]

### Nets
1.2V: C25.1 C28.1 C29.1 C30.1 C31.1 C35.1 C36.1 C37.1 C38.1 C39.1 C40.1 C41.1 C42.1 C45.1 C46.1 C47.1 C48.1 C53.1 C55.1 U19.9(A:VDD12_2) U19.18(A:VDD12_3) U19.25(A:VDD12_4) U19.33(A:VDD12_5) U19.41(A:VDD12) U19.55(B:VDD12_2) U19.78(B:VDD12_3) U19.83(B:VDD12_4) U19.93(B:VDD12) ; also sheet 1
3.3V: C4.1 C5.1 C6.1 C7.1 C8.1 C9.1 C14.1 C15.1 C16.1 C17.1 C18.1 C21.1 C22.1 C23.1 C24.1 C44.1 C49.1 C81.1 R16.1 R17.1 R19.1 R20.1 R24.1 R42.1 U18.3(VCC) U19.26(A:VDD33_2) U19.44(A:VDD33) U19.53(B:VDD33_2) U19.62(B:VDD33_3) U19.67(B:VDD33_4) U19.79(B:VDD33_5) U19.86(B:VDD33_6) U19.99(B:VDD33) Y1.1(!TRI_STATE) Y1.4(VDD) ; also sheet 1
3V3_EN: U17.39(OSC1/CLKI/RA7) ; also sheet 1
5V: C1.1 C2.1 C10.1 C11.1 C27.1 C77.1 C78.1 C79.1 PK3.4 R4.1 U17.10(VDD_2) U17.19(AVDD) U17.26(VDD_3) U17.38(VDD_4) U17.57(VDD) ; also sheet 1
5V_MB: PK3.3 ; also sheet 1
!GNSS_PWR_EN: U17.22(RA2/AN2/VREF-) ; also sheet 1
!GNSS_RES: !GNSSRES.P$1 !GNSSRES.P$2 U17.17(RF1/AN6/C2OUT) ; also sheet 1
!GNSS_VBUS_EN: U17.15(RF3/AN8) ; also sheet 1
!HUB_RES: !HUBRES.P$1 !HUBRES.P$2 R36.1 U17.48(RB0/INT0)
!SPI1_SS: SS1.P$2 U17.11(RF7/!SS1) ; also sheet 1
!SPI1_SS_AUX: J10.4 SS1AUX.P$2 U17.33(RC2/ECCP1/P1A)
!SPI2_SS: R17.2 SS2.P$1 SS2.P$2 U17.49(RD7/PSP7/!SS2) U19.69(B:PF20/CFG_NON_REM/!SPI_CE)
!SPI2_SS_AUX: J11.4 SS2AUX.P$2
!URST: !URST.P$1 Q8.3(C) R42.2 U18.2(!RESET) U19.1(A:RESET_N)
!VBUS1_FLT: U17.16(RF2/AN7/C1OUT) ; also sheet 1
!VBUS2_FLT: U17.45(RB3/INT3) ; also sheet 1
!VBUS3_FLT: U17.53(RD3/PSP3) ; also sheet 1
!VBUS4_FLT: U17.44(RB4/KBI0) ; also sheet 1
ANA_EXT_TEMP: ANEXTEMP.P$1 ANEXTEMP.P$2 U17.24(RA0/AN0) ; also sheet 1
CLK_25MHZ: U19.98(B:XTALI/CLK_IN) Y1.3(OUT)
GND: C1.2 C2.2 C4.2 C5.2 C6.2 C7.2 C8.2 C9.2 C10.2 C11.2 C14.2 C15.2 C16.2 C17.2 C18.2 C21.2 C22.2 C23.2 C24.2 C25.2 C27.2 C28.2 C29.2 C30.2 C31.2 C35.2 C36.2 C37.2 C38.2 C39.2 C40.2 C41.2 C42.2 C44.2 C45.2 C46.2 C47.2 C48.2 C49.2 C53.2 C55.2 C77.2 C78.2 C79.2 C81.2 J12.3 PK3.5 PK3.6 Q8.2(E) R14.2 R15.2 R21.1 R34.2 R51.2 U17.9(VSS_2) U17.20(AVSS) U17.25(VSS_3) U17.41(VSS_4) U17.56(VSS) U18.1(GND) U19.101(B:VSS) Y1.2(GND) ; also sheet 1
GNSS_ANT_DET: GNSSANTDET.P$1 GNSSANTDET.P$2 U17.18(RF0/AN5) ; also sheet 1
GNSS_ANT_OK: GNSSANTOK.P$1 GNSSANTOK.P$2 U17.21(RA3/AN3/VREF+) ; also sheet 1
MB_PWR_EN: U17.30(RC0/T1OSO/T13CKI) ; also sheet 1
N$7: PIC_RF6.P$1 U17.12(RF6/AN11)
N$20: TXD2.P$1 U17.4(RG1/TX2/CK2)
N$28: R14.1 R24.2 U19.21(A:CFG_STRAP1)
N$29: R34.1 U19.22(A:CFG_STRAP2)
N$30: R15.1 U19.24(A:TESTEN)
N$31: R20.2 U19.63(B:TEST1)
N$32: R19.2 U19.65(B:TEST3)
N$33: R21.2 U19.100(B:RBIAS)
N$34: R16.2 U19.64(B:TEST2)
N$35: ATEST.P$1 U19.96(B:ATEST)
N$37: PIC_RF5.P$1 U17.13(RF5/AN10/CVREF)
N$39: PIC_RF4.P$1 U17.14(RF4/AN9)
N$40: PIC_RA1.P$1 U17.23(RA1/AN1)
N$43: RXD2.P$1 U17.5(RG2/RX2/DT2)
N$47: SS2AUX.P$1 U17.1(RE1/!WR/P2C)
N$48: J12.1 PIC_RA5.P$1 U17.27(RA5/AN4/HLVDIN)
N$49: J12.2 PIC_RA4.P$1 U17.28(RA4/T0CKI)
N$53: PIC_RC1.P$1 U17.29(RC1/T1OSI/ECCP2/P2A)
N$54: PIC_RE2.P$1 U17.64(RE2/!CS/P2B)
N$55: PIC_RE3.P$1 U17.63(RE3/P3C)
N$56: PIC_RE4.P$1 U17.62(RE4/P3B)
PC_USB2_HOST_DM: R43.2 ; also sheet 1
PC_USB2_HOST_DP: R18.2 ; also sheet 1
PRT_CTL1: U19.60(B:PF17/PRT_CTL1/OCS) ; also sheet 1
PRT_CTL2: U19.58(B:PF15/PRT_CTL2/OCS) ; also sheet 1
PRT_CTL3: U19.59(B:PF16/PRT_CTL3/OCS) ; also sheet 1
PRT_CTL4: U19.56(B:PF13/PRT_CTL4/OCS) ; also sheet 1
PWR_BYP3: Q8.1(B) R36.2 R51.1
RB6(PGC)_IB: PK3.10 U17.42(RB6/KBI2/PGC)
RB6(PGC)_MB: PK3.9 ; also sheet 1
RB7(PGD)_IB: PK3.8 U17.37(RB7/KBI3/PGD)
RB7(PGD)_MB: PK3.7 ; also sheet 1
SPI1_SCK: J10.3 SCK1.P$1 SCK1.P$2 U17.34(RC3/SCK1/SCL1) ; also sheet 1
SPI1_SDI: J10.2 SDI1.P$1 SDI1.P$2 U17.35(RC4/SDI1/SDA1) ; also sheet 1
SPI1_SDO: J10.1 SDO1.P$1 SDO1.P$2 U17.36(RC5/SDO1) ; also sheet 1
SPI2_SCK: J11.3 SCK2.P$1 SCK2.P$2 U17.50(RD6/PSP6/SCK2/SCL2) U19.68(B:PF21/SPI_CLK)
SPI2_SDI: J11.2 SDI2.P$1 SDI2.P$2 U17.51(RD5/PSP5/SDI2/SDA2) U19.70(B:PF22/CFG_BC_EN/SPI_D0(DOUT))
SPI2_SDO: J11.1 SDO2.P$1 SDO2.P$2 U17.52(RD4/PSP4/SDO2) U19.71(B:PF23/SPI_D1(DIN))
TEMP_PWR_EN: U17.54(RD2/PSP2) ; also sheet 1
UART1_RXD: RXD1.P$1 RXD1.P$2 U17.32(RC7/RX1/DT1) ; also sheet 1
UART1_TXD: TXD1.P$1 TXD1.P$2 U17.31(RC6/TX1/CK1) ; also sheet 1
UART2_RXD: RXD2.P$2 ; also sheet 1
UART2_TXD: TXD2.P$2 ; also sheet 1
USB2DN-1_DM: U19.6(A:USB2DN_DM1/PRT_DIS_M1) ; also sheet 1
USB2DN-1_DP: U19.5(A:USB2DN_DP1/PRT_DIS_P1) ; also sheet 1
USB2DN-2_DM: U19.30(A:USB2DN_DM2/PRT_DIS_M2) ; also sheet 1
USB2DN-2_DP: U19.29(A:USB2DN_DP2/PRT_DIS_P2) ; also sheet 1
USB2DN-3_DM: U19.15(A:USB2DN_DM3/PRT_DIS_M3) ; also sheet 1
USB2DN-3_DP: U19.14(A:USB2DN_DP3/PRT_DIS_P3) ; also sheet 1
USB2DN-4_DM: U19.38(A:USB2DN_DM4/PRT_DIS_M4) ; also sheet 1
USB2DN-4_DP: U19.37(A:USB2DN_DP4/PRT_DIS_P4) ; also sheet 1
USB2UP_DM: R43.1 U19.90(B:USB2UP_DM)
USB2UP_DP: R18.1 U19.89(B:USB2UP_DP)
USB3UP-A_RXDM: U19.95(B:USB3UP_RXDMA) ; also sheet 1
USB3UP-A_RXDP: U19.94(B:USB3UP_RXDPA) ; also sheet 1
USB3UP-A_TXDM: U19.92(B:USB3UP_TXDMA) ; also sheet 1
USB3UP-A_TXDP: U19.91(B:USB3UP_TXDPA) ; also sheet 1
VBUS_MON_UP: U19.80(B:VBUS_MON_UP) ; also sheet 1
VPP: PK3.2 R4.2 U17.7(!MCLR/VPP/RG5)
VPP_MB: PK3.1 ; also sheet 1
Unconnected: PK3.11 PK3.12 SS1.P$1 SS1AUX.P$1 U17.2(RE0/!RD/P2D) U17.3(RG0/ECCP3/P3A) U17.6(RG3/CCP4/P3D) U17.8(RG4/CCP5/P1D) U17.40(OSC2/CLKO/RA6) U17.43(RB5/KBI1/PGM) U17.46(RB2/INT2) U17.47(RB1/INT1) U17.55(RD1/PSP1) U17.58(RD0/PSP0) U17.59(RE7/ECCP2/P2A) U17.60(RE6/P1B) U17.61(RE5/P1C) U19.2(A:PF30/VBUS_DET) U19.3(A:PF31) U19.4(A:DP1_VBUS_MON) U19.7(A:USB3DN_TXDP1A) U19.8(A:USB3DN_TXDM1A) U19.10(A:USB3DN_RXDP1A) U19.11(A:USB3DN_RXDM1A) U19.12(A:DP1_CC1) U19.13(A:DP1_CC2) U19.16(A:USB3DN_TXDP1B) U19.17(A:USB3DN_TXDM1B) U19.19(A:USB3DN_RXDP1B) U19.20(A:USB3DN_RXDM1B) U19.23(A:CFG_STRAP3) U19.27(A:DP2_CC1) U19.28(A:DP2_CC2) U19.31(A:USB3DN_TXDP2A) U19.32(A:USB3DN_TXDM2A) U19.34(A:USB3DN_RXDP2A) U19.35(A:USB3DN_RXDM2A) U19.36(A:PD2_VBUS_MON) U19.39(A:USB3DN_TXDP2B) U19.40(A:USB3DN_TXDM2B) U19.42(A:USB3DN_RXDP2B) U19.43(A:USB3DN_RXDM2B) U19.45(A:PF4/DP2_DISCHARGE) U19.46(A:PF5/DP1_DISCHARGE) U19.47(A:PF6) U19.48(A:PF7) U19.49(A:PF8) U19.50(A:PF9) U19.51(A:PF10) U19.52(B:PF11) U19.54(B:PF12) U19.57(B:PF14) U19.61(B:PF18) U19.66(B:PF19) U19.72(B:PF24/SPI_D2) U19.73(B:PF25/SPI_D3) U19.74(B:PF29) U19.75(B:PF26) U19.76(B:PF27) U19.77(B:PF28) U19.81(B:USB3UP_TXDPB) U19.82(B:USB3UP_TXDMB) U19.84(B:USB3UP_RXDPB) U19.85(B:USB3UP_RXDMB) U19.87(B:CC1_UP) U19.88(B:CC2_UP) U19.97(B:XTALO)

### Notes on the sheet
- ________________________ POWER SUMMARY ________________________
- INTERFACE BOARD CONTROLLER
- RAIL
  -----------
  5V
   |
   |
   |
   |
   |
   |
   |
   |
   |__-5V
   |
   |__3.3V
   |
   |
   |__1.2V
- CKT DESC.
  -------------------------
  RS232 XCEIVER
  RS485 XCEIVER
  USB2 PWR SW
  USB2 PWR SW
  LDO REG / USB HUB
  LDO REG / USB HUB
  PIC MCU
  MEAS. BRD
  
  V.INV / MEAS. BRD
  
  PWR SUPERVISOR
  USB HUB
  
  USB HUB
- CHIP REF.
  ------------
  U__
  U__
  U__
  U__
  U__ + U__
  U__ + U__
  U__
  MB
  
  U__ + MB
  
  U__
  U__
  
  U__
- MAX. CURRENT
  ------------------------
  10 mA
    1 mA
    1 mA +  530 mA
    1 mA + 1060 mA
    1 mA +  70  mA
    1 mA +    1  mA
  30 mA
  250 mA
  
  12 mA + 50 mA
  
    6 uA
  64 mA
  
  465 mA
- RAIL CURRENT
  -------------------
  1956 mA
  (PB+ req.)
  
  
  
  
  
  
  
   62 mA
  
   64 mA
  
  
  465 mA
- POUT
  ---------------------
  9.80 W
  
  
  
  
  
  
  
  
  0.31 W
  
  0.21 W
  
  
  1.20 W
  ===========
  10.8W / ~80%
  = 13.6W PWR IN
- PIN 57
- PIC PRGM HEADER
- MB
  (BOTTOM)
- IB
  (TOP)
- PICKIT3         DESC.
  -------     --------------
      1       VPP / !MCLR
      2       VDD Target
      3       VSS GND
      4       ICSPDAT / PGD
      5       ICSPCLK / PGC
      6       LVP
- NC | NC
- INTERFACE BOARD CONN SUMMARY
- CONN
  --------
  J1
  J2
  J3
  J4
  J5
  J6
  J7
  J8
  J9
  
  PK3CON
- FUNC
  ------------------------------------------------
  (IN, DATA) PWR IN + COMM
  (DATA) PANEL PC COMM, USB
  (DATA) PANEL PC COMM, RS232
  (OUT, DATA) MEAS BRD PWR, COMM
  (RF) GNSS ANTENNA, SMA
  (OUT, SIG) TEMP SENSOR PWR, ANA TEMP
  (DATA) USB (TYPE A)
  (DATA) USB (TYPE A)
  (DATA) USB (TYPE A)
  
  PICKIT3 PROGRAMMING
- no pin connections req'd
  for internal oscillator mode
- PIN 10
- PIN 38
- (RxD)
- (TxD)
- UART DEBUG HEADER
- PIN 26
- Power Supply, Reset_n Sequencing
  ---------------------------------------------------------
  1.2V, then 3.3V, then de-assertion of RESET_N
- PIN 44 | PIN 26 | PIN 99 | PIN 53 | PIN 62 | PIN 67 | PIN 79 | PIN 86
- USB HUB & PANEL PC
  SPI-MASTER INTERFACE
- POWER
  SUPERVISOR
- PIN 41 | PIN 9 | PIN 18 | PIN 25 | PIN 33 | PIN 93 | PIN 55 | PIN 78 | PIN 83
- (DP2_CC1 control)
- NC
- (DP1_CC1/CC2 control)
- NC
- NC
- (USB 3 Port 1 downstream VBUS detect)
- NC
- (Config. 3 UART support)
- NC
- control outputs not req'd if
  discharge supported by
  VBus power switches
- NC
- NC | CRYSTAL OSCILLATOR
- NC
- (USB 3 Port 1 downstream, Orientation A)
- NC
- NC
- (USB 3 Port 2 downstream, Orientation B)
- NC | NC
- (DP2_CC1 Type C orientation control)
- removed 
  25Mhz TP
- NC
- NC | NC
- NC
- (USB 3 Port 1 downstream orientation detection) | (used with crystal)
- NC
- NC
- NC
- (USB 3 Port 2 downstream, Orientation A)
- NC
- NC
- (USB 3 Port 1 downstream, Orientation B) | NC
- NC
- NC
- NC
- NC
- CONFIG. 4
  STRAPS
- NC
- (Config 1 - 6. resistor encoding) | (Type C orientation detection)
- NC
- NC | NC
- NC | (leave disconnected per datasheet)
- (USB 3 Port 2 downstream orientation detection) | NC
- NC
- NC
- NC
- NC
- NC
- NC
- NC
- NC
- NC
- NC

## Library data of the parts
1V2 3V3 5V 5VIN 5VMB !GNSSPWREN !GNSSVBEN !URST !VB1FLT !VB2FLT !VB3FLT !VB4FLT -5VMB ATEST GND GNSS3V3 GNSSGND GNSSINT GNSSPLS GNSSRX GNSSTX GNSSVDDU MBPWREN PCVBUS PIC_RA1 PIC_RA4 PIC_RA5 PIC_RC1 PIC_RE2-PIC_RE4 PIC_RF4-PIC_RF6 TEMP_5V TMPWREN VBUS1-VBUS4 = TTECH:TST_POINT_PTH_042-OCT; PART_DESC: PCB feature, test point, ID 42mil, OD 72mil
5V_ON = TTECH:LED_0603_LITE-ON_LTST-C193KRKT-2A: http://octopart.com/ltst-c190tbkt-lite-on-550003; MANUFACTURER: LITE-ON; MANUFACTURER_PART_NUMBER: LTST-C193KRKT-2A; PART_DESC: Red 629nm LED Indication - Discrete 1.9V 0603 (1608 Metric)
!GNSSRES !HUBRES ANEXTEMP GNSSANTDET GNSSANTOK RXD1 RXD2 SCK1 SCK2 SDI1 SDI2 SDO1 SDO2 SS1 SS1AUX SS2 SS2AUX TXD1 TXD2 = TTECH:TST_POINT_PTH_20X40MIL_2PIN; PART_DESC: PCB FEATURE, TEST POINT, ID 20MIL, OD 40MIL
C1-C3 C7-C9 C11-C13 C17 C18 C23-C25 C29 C31 C34 C37 C38 C41 C42 C46 C48 C49 C63 C64 C68 C69 C78 C81 = TTECH:CAP_CER_0402_MURATA; MANUFACTURER: MURATA; MANUFACTURER_PART_NUMBER: GCM155R71C104KA55D; PART_DESC: CAP CER 0.1UF 16V X7R 0402
C4-C6 C14-C16 C21 C22 C28 C30 C35 C36 C39 C40 C45 C47 C55 = TTECH:CAP_CER_0402_MURATA; MANUFACTURER: MURATA; MANUFACTURER_PART_NUMBER: C0402C102K4RAC7867; PART_DESC: CAP CER 1000PF 16V X7R 0402
C10 C27 C77 C79 = TTECH:CAP_CER_0603_TDK; MANUFACTURER: MURATA; MANUFACTURER_PART_NUMBER: GRM188D71A106KA73D; PART_DESC: CAP CER 10UF 10V X7T 0603
C19 C20 C50 C59 C72 C73 = TTECH:CAP_CER_0402_MURATA; MANUFACTURER: MURATA; MANUFACTURER_PART_NUMBER: GCM155C71A105KE38D; PART_DESC: CAP CER 1UF 10V X7S 0402
C26 = TTECH:CAP_CER_0603_TDK; MANUFACTURER: KEMET; MANUFACTURER_PART_NUMBER: C0603C103K4REC7867; PART_DESC: CAP CER 0603 10NF 16V X7R 10%
C32 C56 = TTECH:CAP_CER_0603_TDK; MANUFACTURER: MURATA; MANUFACTURER_PART_NUMBER: GRM188R61A226ME15D; PART_DESC: CAP CER 22UF 10V X5R 0603
C33 C58 C62 C71 = TTECH:CAP_CER_0402_MURATA; MANUFACTURER: DO NOT POPULATE; MANUFACTURER_PART_NUMBER: DO NOT POPULATE; PART_DESC: (Murata GCM155C71A105KE38D) CAP CER 1UF 10V X7S 0402
C43 C54 C60 C61 C65-C67 = TTECH:CAP_CER_0402_MURATA; MANUFACTURER: DO NOT POPULATE; MANUFACTURER_PART_NUMBER: DO NOT POPULATE; PART_DESC: (Murata GCM155R71C104KA55D) CAP CER 0.1UF 16V X7R 0402
C44 C53 C74-C76 = TTECH:CAP_CER_0402_MURATA; MANUFACTURER: MURATA; MANUFACTURER_PART_NUMBER: C1005X5R1A475K050BE; PART_DESC: CAP CER 4.7UF 10V X5R 0402
C51 C52 C70 = TTECH:CAP_CER_0603_TDK; MANUFACTURER: DO NOT POPULATE; MANUFACTURER_PART_NUMBER: DO NOT POPULATE; PART_DESC: (Murata GRM188R60J476ME15D) CAP CER 47UF 6.3V X5R 0603
C80 = TTECH:CAP_CER_0603_TDK; MANUFACTURER: TDK; MANUFACTURER_PART_NUMBER: C0805X106M9RAC7800; PART_DESC: CAP CER 10UF 6.3V X7R 0805
CR1 = TTECH:DIODE_TVS_BIDIRECT_COMCHIP; MANUFACTURER: COMCHIP; MANUFACTURER_PART_NUMBER: ACPDQC3V3HT-HF; PART_DESC: 7V (Typ) Clamp 17A (8/20µs) Ipp Tvs Diode Surface Mount 0402C/SOD-923F
GNSSPULSE = TTECH:LED_0603; COPYRIGHT: Copyright (C) 2022 Ultra Librarian. All rights reserved.; MANUFACTURER: DIALIGHT; MANUFACTURER_PART_NUMBER: 598-8081-107F; PART_DESC: LED GREEN CLEAR 0603 SMD
J1 = TTECH:CON_MOLEX_1053131306; MANUFACTURER: MOLEX; MANUFACTURER_PART_NUMBER: 1053131306; PART_DESC: CONN HEADER R/A 6POS 2.5MM
J2 = TTECH:CON_MOLEX_1053141310; MANUFACTURER: MOLEX; MANUFACTURER_PART_NUMBER: 1053141310; PART_DESC: CONN HEADER R/A 10POS 2.5MM
J3 = TTECH:CON_MOLEX_1053131303; MANUFACTURER: MOLEX; MANUFACTURER_PART_NUMBER: 1053131303; PART_DESC: CONN HEADER R/A 3POS 2.5MM
J4 = TTECH:CON_3M_RA_N3314-5302RB; MANUFACTURER: 3M; MANUFACTURER_PART_NUMBER: N3314-5202RB; PART_DESC: Headers & Wire Housings 14P R/A SHORT PIN SOLDER TAIL 30u GOLD
J5 = TTECH:SAMTEC_SMA-J-P-X-ST-TH1_V.2: SMA STRAIGHT, THROUGH HOLE JACK- 50 OHM; MANUFACTURER: SAMTEC; MANUFACTURER_PART_NUMBER: SMA-J-P-X-ST-TH1; PART_DESC: 50 Ohm SMA Jack Board Connector
J6 = TTECH:CON_MOLEX_1053131304; MANUFACTURER: MOLEX; MANUFACTURER_PART_NUMBER: 1053131304; PART_DESC: CONN HEADER R/A 4POS 2.5MM
J7-J9 = TTECH:CON_MOLEX_1054301305; COPYRIGHT: Copyright (C) 2022 Ultra Librarian. All rights reserved.; MANUFACTURER: DO NOT POPULATE; MANUFACTURER_PART_NUMBER: DO NOT POPULATE; PART_DESC: (Molex 1054301305) Headers & Wire Housings Nano-Fit 2.5mm RA Hdr SMT SR 5Ckt GW
J10 J11 = TTECH:MOLEX_VERT-HDR_1718561004; MANUFACTURER: DO NOT POPULATE; MANUFACTURER_PART_NUMBER: DO NOT POPULATE; PART_DESC: (Molex 1718561004) CONN HEADER VERT 4POS 2.54MM
J12 = TTECH:SULLINS_MALE-HDR_050_GRPB031VWVN-RC; MANUFACTURER: SULLINS; MANUFACTURER_PART_NUMBER: GRPB031VWVN-RC; PART_DESC: CONN HEADER VERT 3POS 1.27MM
L1 = TTECH:IND_TAIYO-YUDEN_NR3012T2R2M; COPYRIGHT: Copyright (C) 2022 Ultra Librarian. All rights reserved.; MANUFACTURER: TAIYO YUDEN; MANUFACTURER_PART_NUMBER: NR3012T2R2M; PART_DESC: FIXED IND 2.2UH 1.2A 96 MOHM SMD
L2 = TTECH:INDUCTOR_0603_TDK; COPYRIGHT: Copyright (C) 2023 Ultra Librarian. All rights reserved.; MANUFACTURER: TDK; MANUFACTURER_PART_NUMBER: B82496C3270J000; PART_DESC: 27 nH Unshielded Drum Core, Wirewound Inductor 360 mA 550mOhm Max 0603 (1608 Metric)
PK3 = TTECH:CON_MOLEX_901311086; MANUFACTURER: MOLEX; MANUFACTURER_PART_NUMBER: 901311086; PART_DESC: CONN HEADER VERT 12POS 2.54MM
PTH1-PTH4 = TTECH:PTH_M4_4.5MM-ID_MIDDLE-FIT; PART_DESC: PCB feature, PTH mounting (hole), M4
Q1 Q5 = TTECH:FDS4435BZ; MANUFACTURER: ONSEMI; MANUFACTURER_PART_NUMBER: SI4463DY; PART_DESC: P-Channel 20 V 11.5A (Ta) 1W (Ta) Surface Mount 8-SOIC
Q2 Q4 Q6-Q8 = TTECH:MMBT2222ATT3G; DESCRIPTION: Transistor, gen purpose, NPN; MANUFACTURER: ONSEMI; MANUFACTURER_PART_NUMBER: MMBT2222ATT3G; PART_DESC: TRANS NPN 40V 0.6A SC75 SOT416
Q3 = TTECH:MOSFET_P-CH_VISHAY_SI2301CDS-T1-BE3; COPYRIGHT: Copyright (C) 2022 Ultra Librarian. All rights reserved.; MANUFACTURER: VISHAY; MANUFACTURER_PART_NUMBER: SI2301CDS-T1-BE3; PART_DESC: P-CHANNEL 20-V (D-S) MOSFET
R1 R11 R35 R36 R41 = TTECH:RES_0402_VISHAY: RES SMD ... 0402; MANUFACTURER: VISHAY; MANUFACTURER_PART_NUMBER: CRCW04021K00FKEDC; PART_DESC: RES 1K OHM 1% 1/16W 0402
R2 R3 = TTECH:RES_0402_VISHAY: RES SMD ... 0402; MANUFACTURER: DO NOT POPULATE; MANUFACTURER_PART_NUMBER: DO NOT POPULATE; PART_DESC: (TEConnn CRGCQ0402F27R) RES 27 OHM 1% 1/16W 0402
R4-R6 R8 R9 R12 R13 R15-R17 R19 R20 R24 R31 R44 R47-R51 = TTECH:RES_0402_VISHAY: RES SMD ... 0402; MANUFACTURER: VISHAY; MANUFACTURER_PART_NUMBER: CRCW040210K0FKEDC; PART_DESC: RES 10K OHM 1% 1/16W 0402
R7 = TTECH:RES_0402_VISHAY: RES SMD ... 0402; MANUFACTURER: STACKPOLE; MANUFACTURER_PART_NUMBER: RMCF0402FT11K0; PART_DESC: RES 11K OHM 1% 1/16W 0402
R10 = TTECH:RES_0402_VISHAY: RES SMD ... 0402; MANUFACTURER: TECONN; MANUFACTURER_PART_NUMBER: CRGCQ0402F1M0; PART_DESC: RES 1M OHM 1% 1/16W 0402
R14 = TTECH:RES_0402_VISHAY: RES SMD ... 0402; MANUFACTURER: DO NOT POPULATE; MANUFACTURER_PART_NUMBER: DO NOT POPULATE; PART_DESC: DNP (0402)
R18 R29 R30 R43 R58 = TTECH:RES_0402_VISHAY: RES SMD ... 0402; MANUFACTURER: VISHAY; MANUFACTURER_PART_NUMBER: CRCW04020000Z0EDC; PART_DESC: RES 0 OHM JUMPER 1/16W 0402
R21 = TTECH:RES_0402_VISHAY: RES SMD ... 0402; MANUFACTURER: VISHAY; MANUFACTURER_PART_NUMBER: CRCW040212K0FKEDC; PART_DESC: RES 12K OHM 1% 1/16W 0402
R22 = TTECH:RES_0402_VISHAY: RES SMD ... 0402; MANUFACTURER: VISHAY; MANUFACTURER_PART_NUMBER: RCS040243K0FKED; PART_DESC: RES SMD 43K OHM 1% 1/5W 0402
R23 = TTECH:RES_0402_VISHAY: RES SMD ... 0402; MANUFACTURER: VISHAY; MANUFACTURER_PART_NUMBER: CRCW040249K9FKEDC; PART_DESC: RES 49.9K OHM 1% 1/16W 0402
R25 R32 R40 = TTECH:RES_0402_VISHAY: RES SMD ... 0402; MANUFACTURER: DO NOT POPULATE; MANUFACTURER_PART_NUMBER: DO NOT POPULATE; PART_DESC: (Vishay CRCW0402330RFKEDC) RES 330 OHM 1% 1/16W 0402
R26-R28 R38 = TTECH:RES_0402_VISHAY: RES SMD ... 0402; MANUFACTURER: DO NOT POPULATE; MANUFACTURER_PART_NUMBER: DO NOT POPULATE; PART_DESC: (Vishay CRCW040210K0FKEDC) RES 10K OHM 1% 1/16W 0402
R33 = TTECH:RES_0402_VISHAY: RES SMD ... 0402; MANUFACTURER: VISHAY; MANUFACTURER_PART_NUMBER: CRCW0402100RFKEDC; PART_DESC: RES 100 OHM 1% 1/16W 0402
R34 = TTECH:RES_0402_VISHAY: RES SMD ... 0402; MANUFACTURER: VISHAY; MANUFACTURER_PART_NUMBER: CRCW0402200KFKED; PART_DESC: RES 200K OHM 1% 1/16W 0402
R37 R39 R42 = TTECH:RES_0402_VISHAY: RES SMD ... 0402; MANUFACTURER: VISHAY; MANUFACTURER_PART_NUMBER: CRCW0402100KFKEDC; PART_DESC: RES 100K OHM 1% 1/16W 0402
R45 R46 = TTECH:RES_0402_VISHAY: RES SMD ... 0402; MANUFACTURER: TECONN; MANUFACTURER_PART_NUMBER: CRGCQ0402F27R; PART_DESC: RES 27 OHM 1% 1/16W 0402
R52-R55 = TTECH:RES_0805_STACKPOLE; COPYRIGHT: Copyright (C) 2022 Ultra Librarian. All rights reserved.; MANUFACTURER: STACKPOLE; MANUFACTURER_PART_NUMBER: HCJ0805ZT0R00; PART_DESC: RES 0 OHM JUMPER 1/2W 0805
R56 = TTECH:RES_0402_VISHAY: RES SMD ... 0402; MANUFACTURER: VISHAY; MANUFACTURER_PART_NUMBER: CRCW04021K30FKED; PART_DESC: RES SMD 1.3K OHM 1% 1/16W 0402
R57 = TTECH:RES_0603_STACKPOLE; COPYRIGHT: Copyright (C) 2022 Ultra Librarian. All rights reserved.; MANUFACTURER: VISHAY; MANUFACTURER_PART_NUMBER: TNPW060310R0FHTA; PACKAGE: (0603); PART_DESC: RES 10 OHM 1% 1/10W 0603
U1 U14 U15 = TTECH:TI_LP5907MFX-3.3/NOPB; COPYRIGHT: Copyright (C) 2022 Ultra Librarian. All rights reserved.; MANUFACTURER: TI; MANUFACTURER_PART_NUMBER: LP5907MFX-3.3/NOPB; PART_DESC: IC REG LINEAR 3.3V 250MA SOT23-5
U2 = TTECH:TI_SW-REG_LM3671; COPYRIGHT: Copyright (C) 2022 Ultra Librarian. All rights reserved.; MANUFACTURER: TI; MANUFACTURER_PART_NUMBER: LM3674MFX-1.2/NOPB; PART_DESC: IC REG BUCK 1.2V 600MA SOT23-5
U3 = TTECH:TVS_ALPHA-OEGA_AOZ8904CIL; COPYRIGHT: Copyright (C) 2022 Ultra Librarian. All rights reserved.; MANUFACTURER: ALPHA & OMEGA; MANUFACTURER_PART_NUMBER: AOZ8904CIL; PART_DESC: TVS DIODE 5.5VWM 18VC SOT23-6
U4 = TTECH:MAXIM_MAX3311EEUB+T; COPYRIGHT: Copyright (C) 2022 Ultra Librarian. All rights reserved.; MANUFACTURER: AD (MAXIM); MANUFACTURER_PART_NUMBER: MAX3311EEUB+T; PART_DESC: IC TRANSCEIVER FULL 1/1 10UMAX
U5 = TTECH:MAXIM_MAX889RESA; MANUFACTURER: AD (MAXIM); MANUFACTURER_PART_NUMBER: MAX889RESA+; PART_DESC: Charge Pump Switching Regulator IC Negative Adjustable -2.5V 1 Output 200mA 8-SOIC (0.154, 3.90mm Width)
U6 = TTECH:MAX3080EESD+; MANUFACTURER: MAXIM; MANUFACTURER_PART_NUMBER: MAX3080EE; PART_DESC: IC TRANSCEIVER FULL 1/1 14SOIC
U7-U9 = TTECH:TVS_ALPHA-OEGA_AOZ8904CIL; COPYRIGHT: Copyright (C) 2022 Ultra Librarian. All rights reserved.; MANUFACTURER: DO NOT POPULATE; MANUFACTURER_PART_NUMBER: DO NOT POPULATE; PART_DESC: (Alpha & Omega AOZ8904CIL) TVS DIODE 5.5VWM 18VC SOT23-6
U10-U13 = TTECH:SW_PWR_1CH_DIODES-INC_AP22816BKAWT; MANUFACTURER: DO NOT POPULATE; MANUFACTURER_PART_NUMBER: DO NOT POPULATE; PART_DESC: (Diodes, Inc. AP22816BKAWT-7) USB Switch ICs USB Power Switch TSOT25
U16 = TTECH:MODULE_UBLOX_NEO-M8Q-01A; MANUFACTURER: U-BLOX; MANUFACTURER_PART_NUMBER: NEO-M8Q-01A; PART_DESC: RF RECEIVER GNSS/GPS 1.575GHZ
U17 = TTECH:PIC18F6627T-E/PT; MANUFACTURER: MICROCHIP; MANUFACTURER_PART_NUMBER: PIC18F6722T-E/PT; PART_DESC: IC MCU 8BIT 128KB FLASH 64TQFP
U18 = TTECH:MICROCHIP_MIC803-29D4VM3; COPYRIGHT: Copyright (C) 2022 Ultra Librarian. All rights reserved.; MANUFACTURER: MICROCHIP; MANUFACTURER_PART_NUMBER: MIC803-29D4VM3-TR; PART_DESC: IC SUPERVISOR 1 CHANNEL SOT23-3
U19 = TTECH:MICROCHIP_USB7002-I/KDX; COPYRIGHT: Copyright (C) 2022 Ultra Librarian. All rights reserved.; MANUFACTURER: MICROCHIP; MANUFACTURER_PART_NUMBER: USB7002-I/KDX; PART_DESC: USB Interface IC USB 3.1 Gen 1 4-port Type C Hub
Y1 = TTECH:CRYSTAL_OSC_ECS-2033-250-BN: subminiature SMD oscillators; MANUFACTURER: ECS; MANUFACTURER_PART_NUMBER: ECS-2033-250-BN; PART_DESC: XTAL OSC XO 25.0000MHZ CMOS SMD

## Net classes
0 default: width 0.152 mm, drill 0.203 mm, clearance 0.152 mm